# Altium schematic sheet 1.SchDoc
size 840 x 594 mm; SheetNumber: 1; SheetTotal: 10
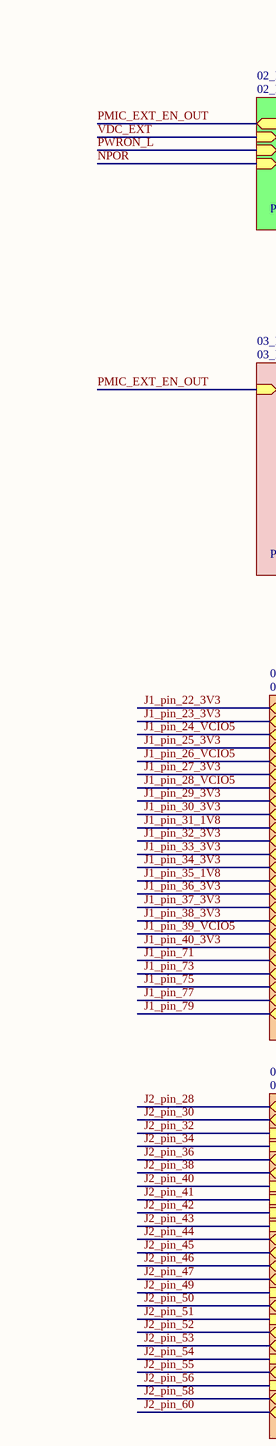
[diagram p0: 1.SchDoc, centre left]
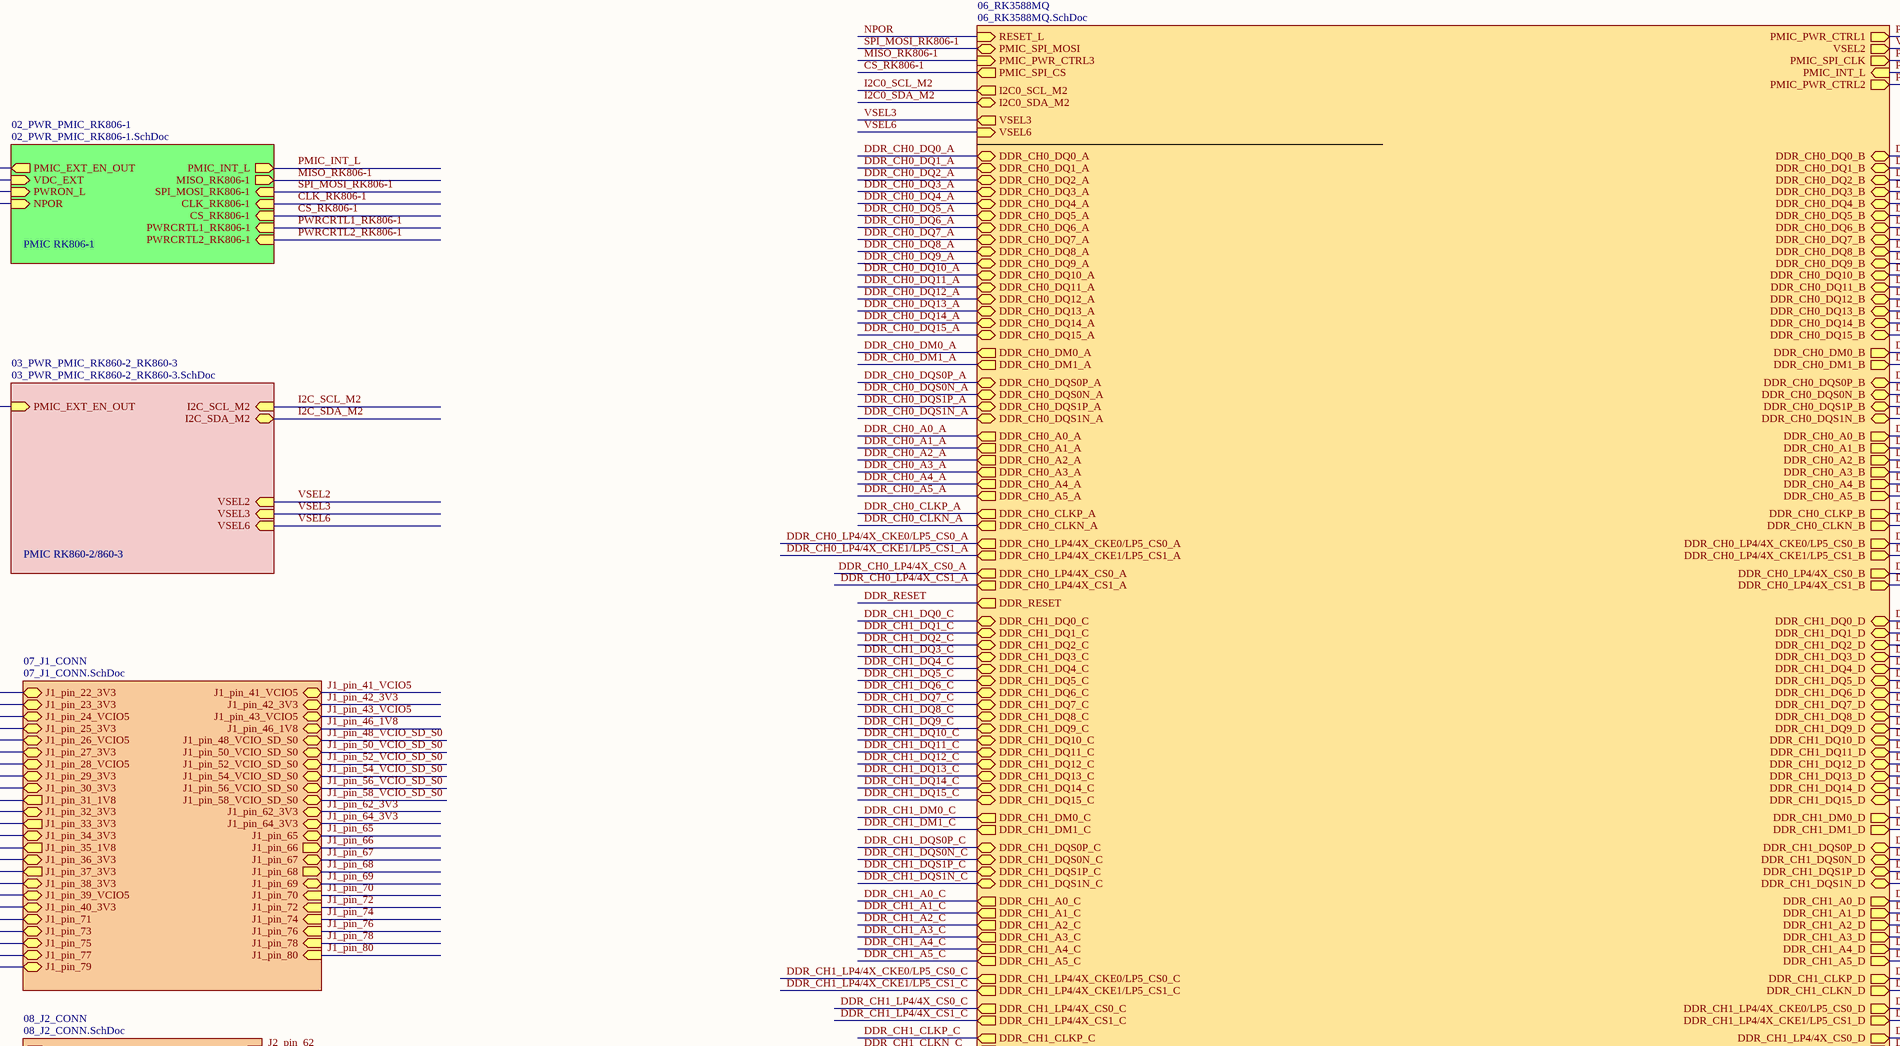
[diagram p1: 1.SchDoc, centre middle]
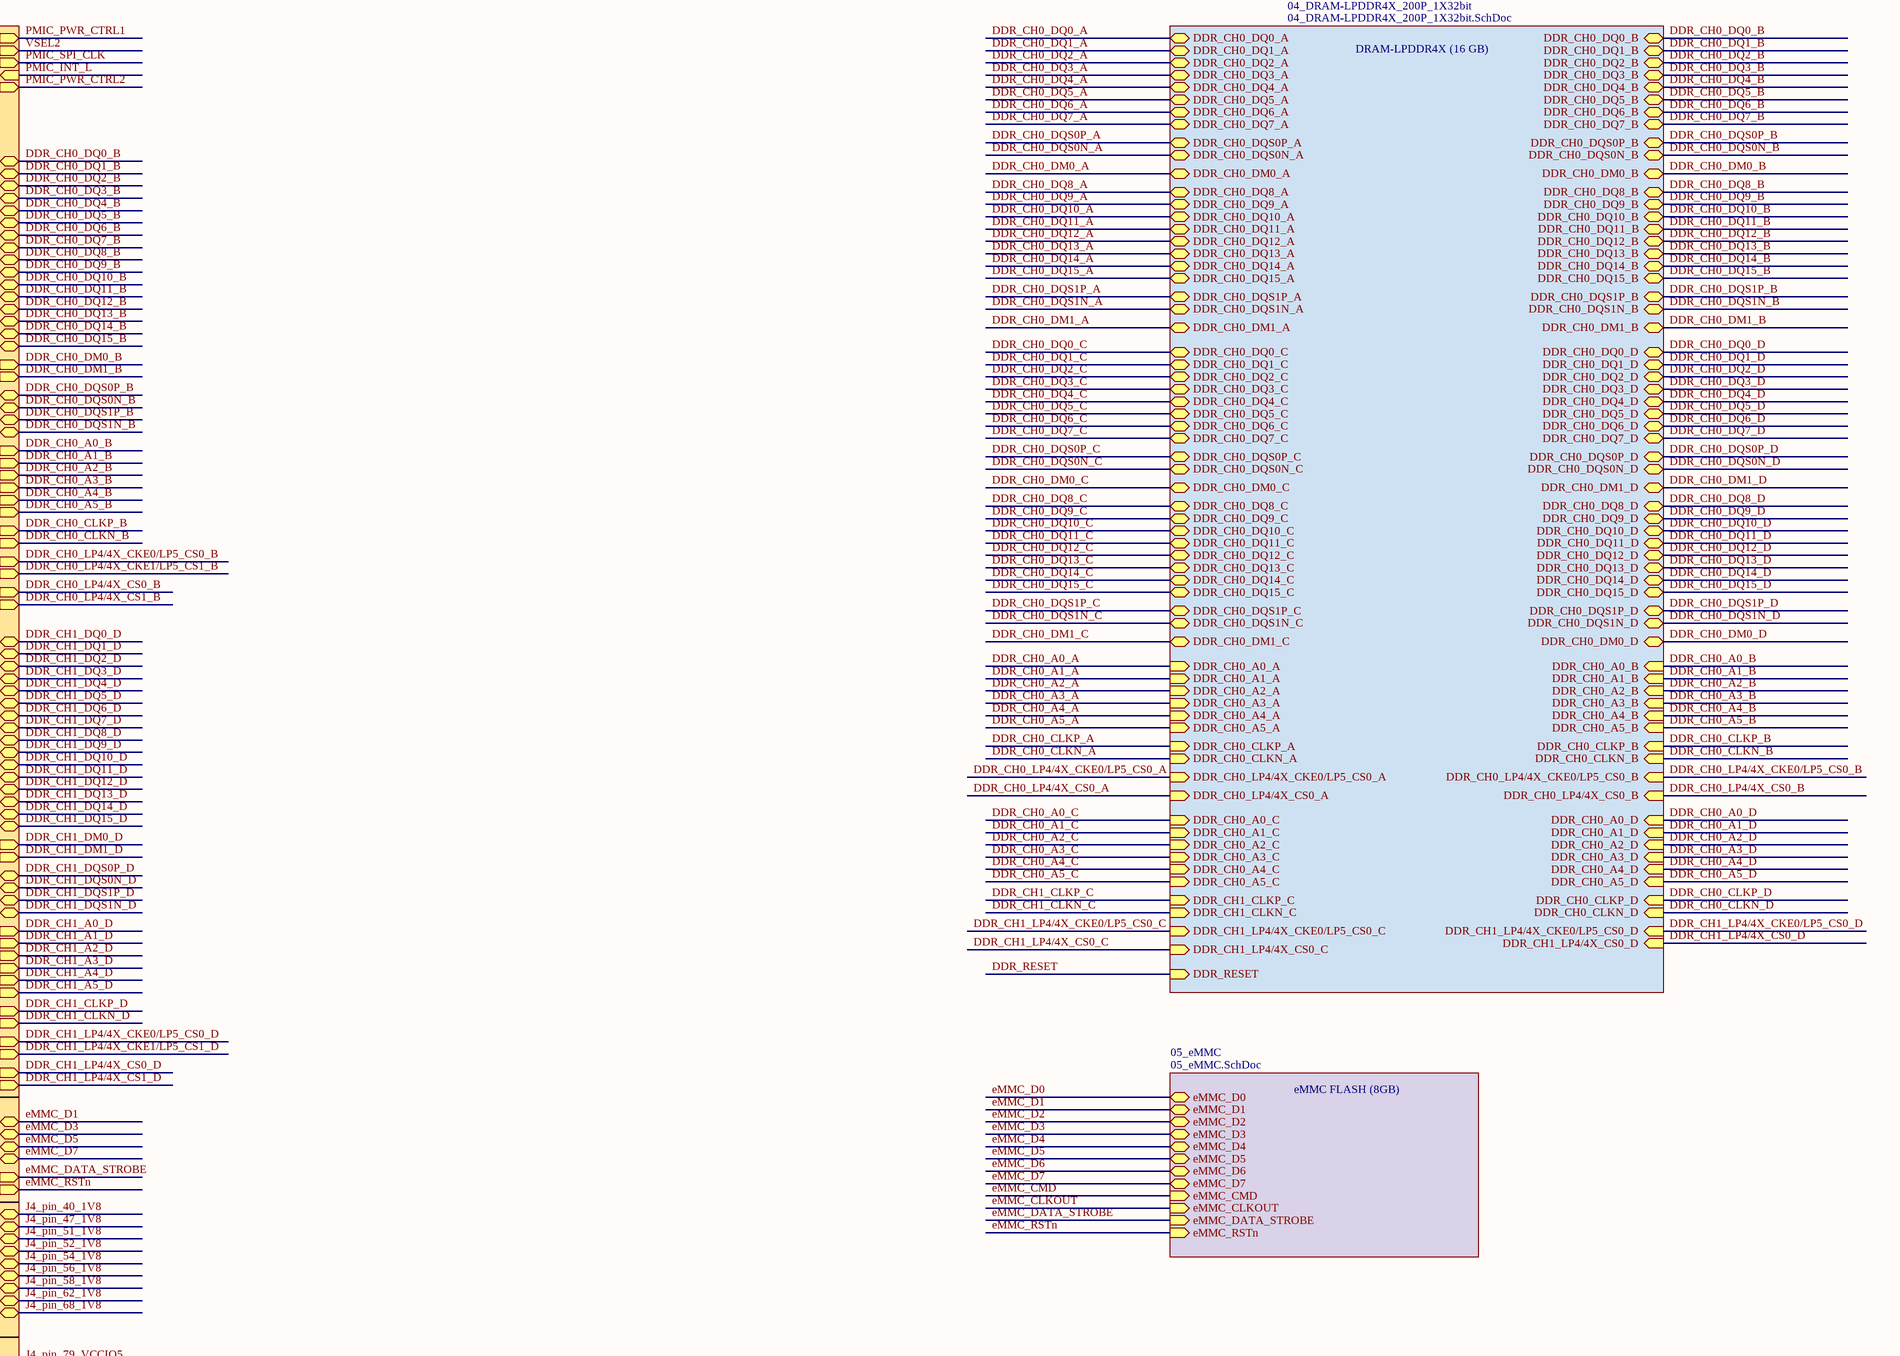
[diagram p2: 1.SchDoc, centre right]
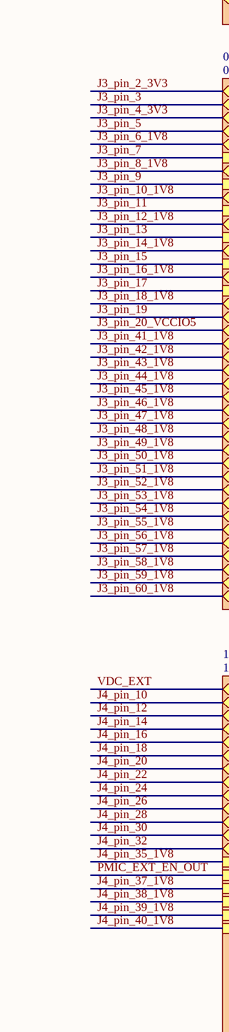
[diagram p3: 1.SchDoc, bottom left]
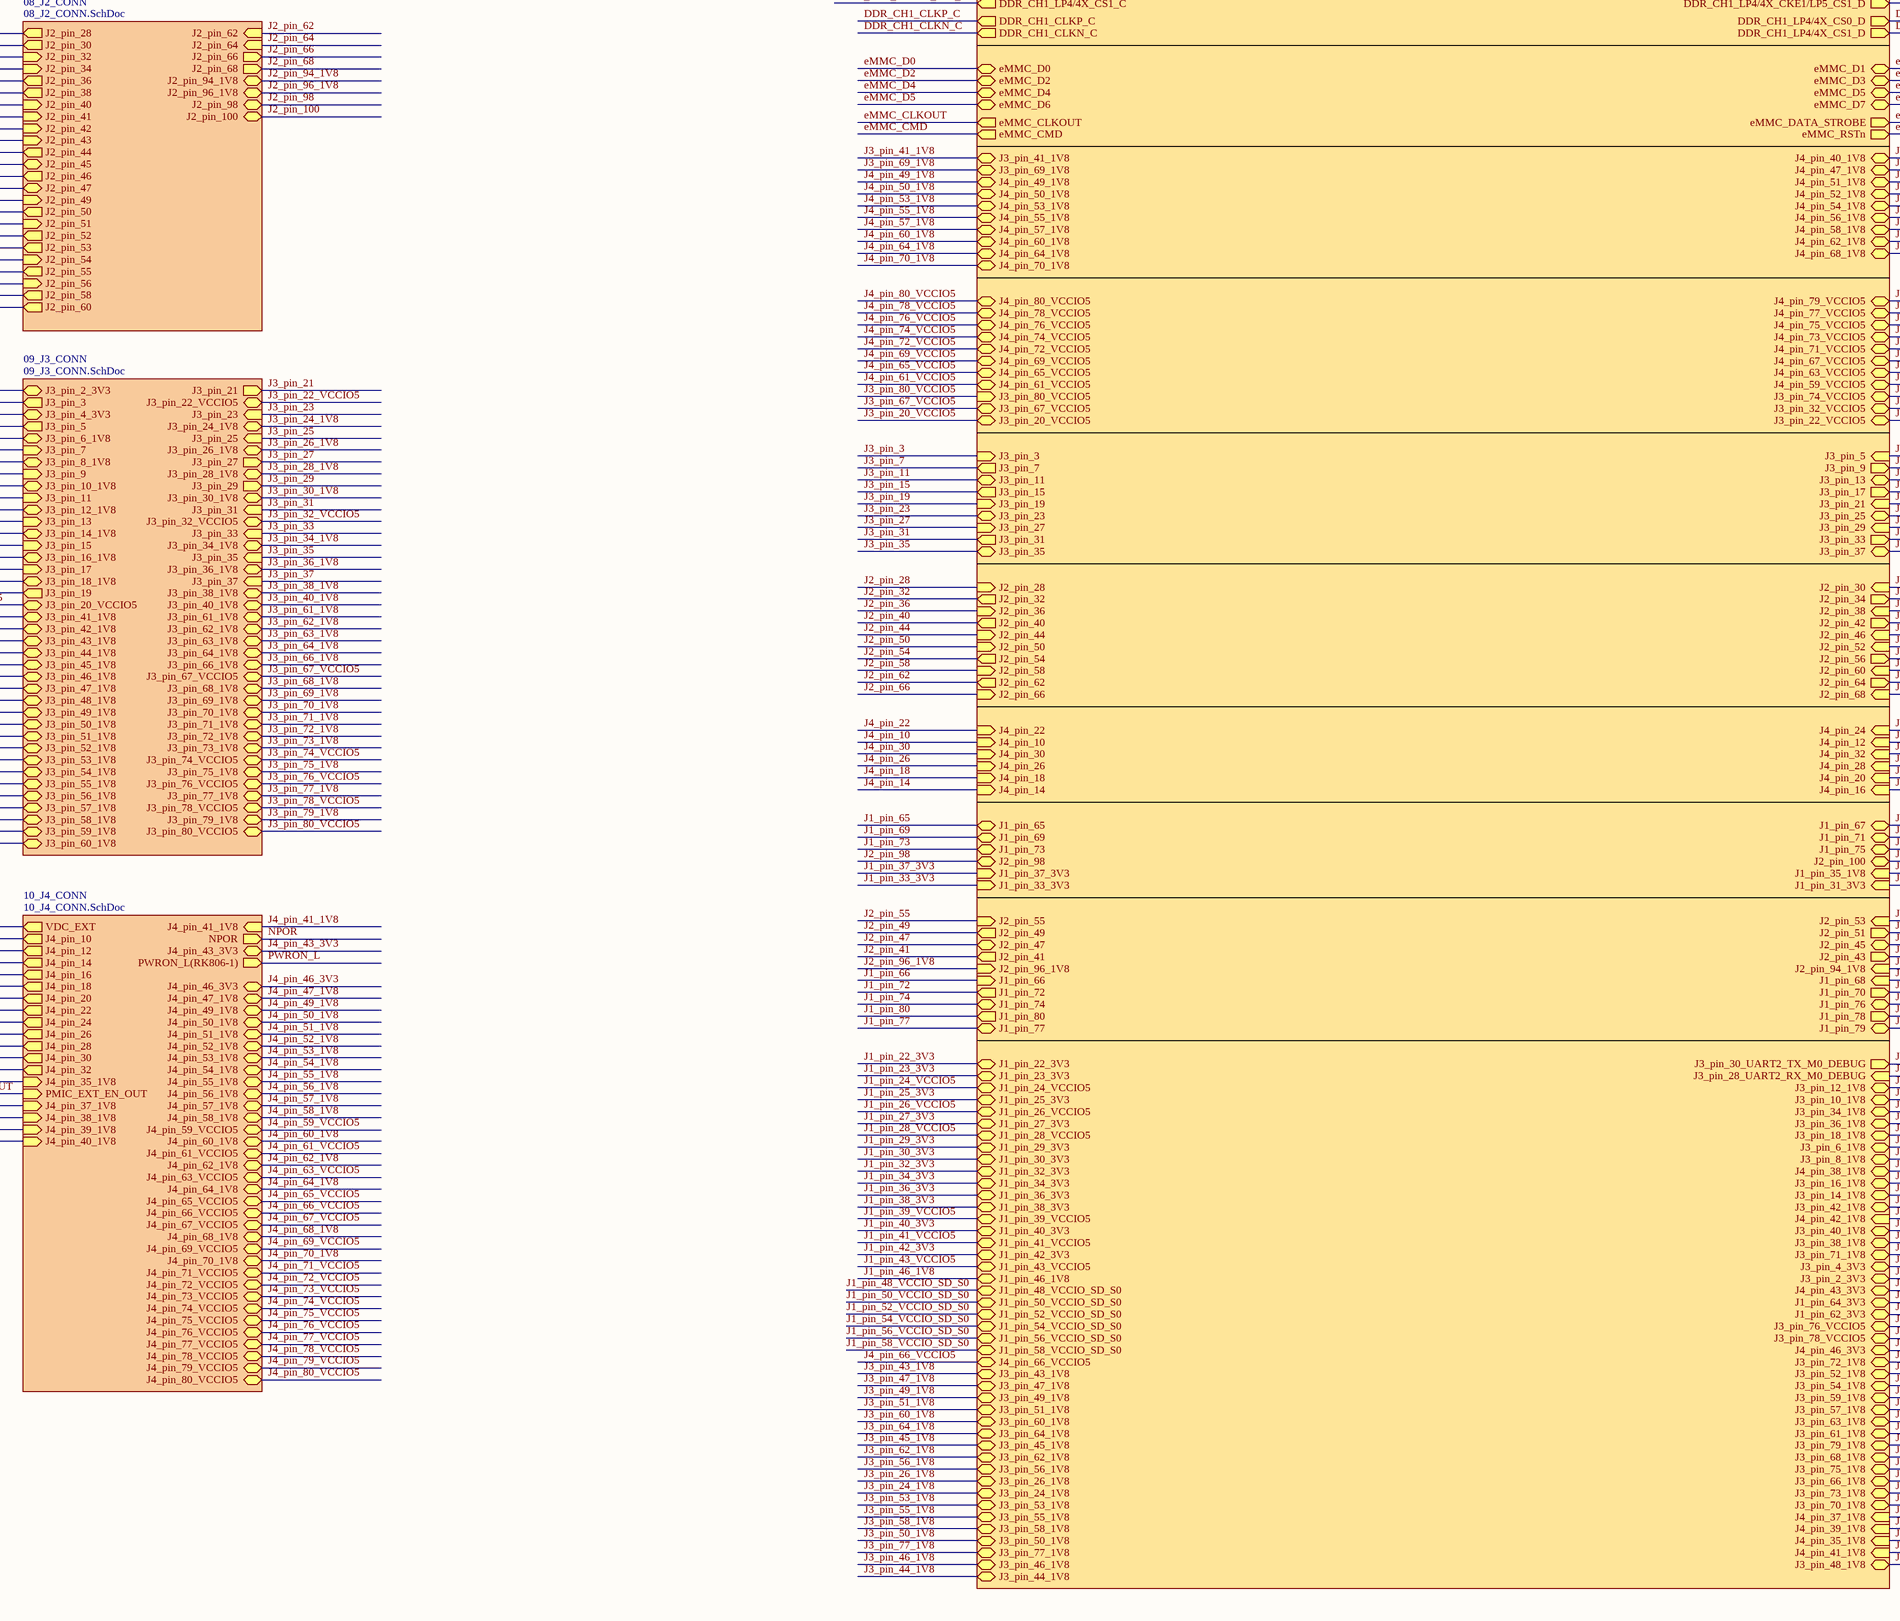
[diagram p4: 1.SchDoc, bottom middle]
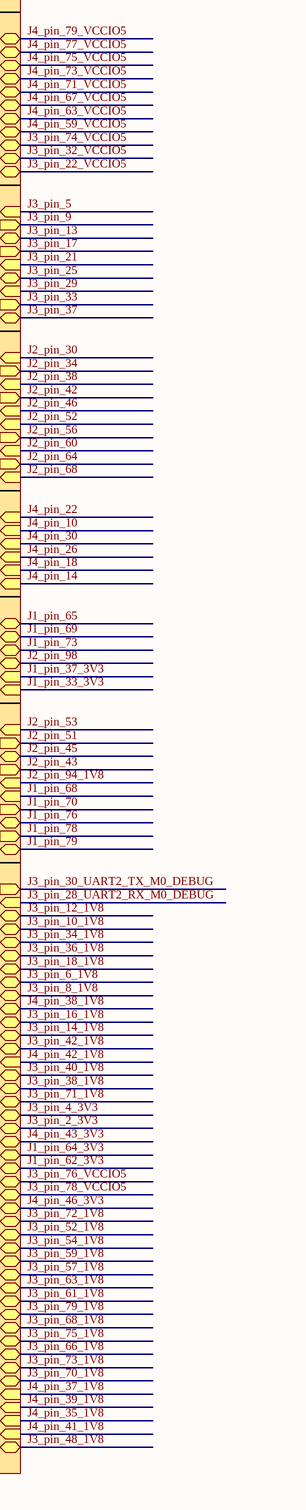
[diagram p5: 1.SchDoc, bottom right]

## Sub-sheets
02_PWR_PMIC_RK806-1 = 02_PWR_PMIC_RK806-1.SchDoc: MISO_RK806-1 (out), PWRCRTL1_RK806-1 (in), PWRCRTL2_RK806-1 (in), CS_RK806-1 (in), CLK_RK806-1 (in), SPI_MOSI_RK806-1 (in), PMIC_INT_L (out), VDC_EXT (in), PMIC_EXT_EN_OUT (out), PWRON_L (in), NPOR (in)
03_PWR_PMIC_RK860-2_RK860-3 = 03_PWR_PMIC_RK860-2_RK860-3.SchDoc: I2C_SCL_M2 (in), PMIC_EXT_EN_OUT (in), I2C_SDA_M2 (bidir), VSEL6 (in), VSEL3 (in), VSEL2 (in)
04_DRAM-LPDDR4X_200P_1X32bit = 04_DRAM-LPDDR4X_200P_1X32bit.SchDoc: DDR_CH0_DQ0_A (bidir), DDR_CH0_DQ1_A (bidir), DDR_CH0_DQ2_A (bidir), DDR_CH0_DQ3_A (bidir), DDR_CH0_DQ4_A (bidir), DDR_CH0_DQ5_A (bidir), DDR_CH0_DQ6_A (bidir), DDR_CH0_DQ7_A (bidir), DDR_CH0_DQ0_B (bidir), DDR_CH0_DQ1_B (bidir), DDR_CH0_DQ2_B (bidir), DDR_CH0_DQ3_B (bidir), DDR_CH0_DQ4_B (bidir), DDR_CH0_DQ5_B (bidir), DDR_CH0_DQ6_B (bidir), DDR_CH0_DQ7_B (bidir), DDR_CH0_DQS0P_B (bidir), DDR_CH0_DM0_A (bidir), DDR_CH0_DQS0P_A (bidir), DDR_CH0_DQS0N_A (bidir), DDR_CH0_DQ15_A (bidir), DDR_CH0_DQ14_A (bidir), DDR_CH0_DQ13_A (bidir), DDR_CH0_DQ12_A (bidir), DDR_CH0_DQ11_A (bidir), DDR_CH0_DQ10_A (bidir), DDR_CH0_DQ9_A (bidir), DDR_CH0_DQ8_A (bidir), DDR_CH0_DM1_A (bidir), DDR_CH0_DQ7_C (bidir), DDR_CH0_DQ6_C (bidir), DDR_CH0_DQ5_C (bidir), DDR_CH0_DQ4_C (bidir), DDR_CH0_DQ3_C (bidir), DDR_CH0_DQ2_C (bidir), DDR_CH0_DQ1_C (bidir), DDR_CH0_DQ0_C (bidir), DDR_CH0_DQS0N_C (bidir), DDR_CH0_DQS0P_C (bidir), DDR_CH0_DM0_C (bidir), DDR_CH0_DQS0N_B (bidir), DDR_CH0_DM0_B (bidir), DDR_CH0_DQ8_B (bidir), DDR_CH0_DQ9_B (bidir), DDR_CH0_DQ10_B (bidir), DDR_CH0_DQ11_B (bidir), DDR_CH0_DQ12_B (bidir), DDR_CH0_DQ13_B (bidir), DDR_CH0_DQ14_B (bidir), DDR_CH0_DQ15_B (bidir), DDR_CH0_DQS1P_B (bidir), DDR_CH0_DQS1N_B (bidir), DDR_CH0_DQS1P_A (bidir), DDR_CH0_DQS1N_A (bidir), DDR_CH0_DM1_B (bidir), DDR_CH0_DQ9_C (bidir), DDR_CH0_DQ8_C (bidir), DDR_CH0_DQ10_C (bidir), DDR_CH0_DQ11_C (bidir), DDR_CH0_DQ12_C (bidir), DDR_CH0_DQ13_C (bidir), DDR_CH0_DQ14_C (bidir), DDR_CH0_DQ15_C (bidir), DDR_CH0_DQS1P_C (bidir), DDR_CH0_DQS1N_C (bidir), DDR_CH0_DQ0_D (bidir), DDR_CH0_DQ1_D (bidir), DDR_CH0_DQ2_D (bidir), DDR_CH0_DQ3_D (bidir), DDR_CH0_DQ4_D (bidir), DDR_CH0_DQ5_D (bidir), DDR_CH0_DQ6_D (bidir), DDR_CH0_DQ7_D (bidir), DDR_CH0_DQS0P_D (bidir), DDR_CH0_DM1_D (bidir), DDR_CH0_DQ8_D (bidir), DDR_CH0_DQ9_D (bidir), DDR_CH0_DQ10_D (bidir), DDR_CH0_DQ11_D (bidir), DDR_CH0_DQ12_D (bidir), DDR_CH0_DQ13_D (bidir), DDR_CH0_DQ14_D (bidir), DDR_CH0_DQ15_D (bidir), DDR_CH0_DQS1P_D (bidir), DDR_CH0_DQS1N_D (bidir), DDR_CH0_DM0_D (bidir), DDR_CH0_DM1_C (bidir), DDR_CH0_A5_A (in), DDR_CH0_A4_A (in), DDR_CH0_A3_A (in), DDR_CH0_A2_A (in), DDR_CH0_A1_A (in), DDR_CH0_CLKN_A (in), DDR_CH0_CLKP_A (in), DDR_CH0_LP4/4X_CKE0/LP5_CS0_A (in), DDR_CH0_A5_C (in), DDR_CH0_A4_C (in), DDR_CH0_A3_C (in), DDR_CH0_A2_C (in), DDR_CH0_A1_C (in), DDR_CH0_A0_C (in), DDR_CH0_A0_A (in), DDR_CH0_LP4/4X_CS0_A (in), DDR_CH1_CLKN_C (in), DDR_CH1_CLKP_C (in), DDR_CH1_LP4/4X_CKE0/LP5_CS0_C (in), DDR_CH1_LP4/4X_CS0_C (in), DDR_RESET (in), DDR_CH0_A0_B (in), DDR_CH0_A1_B (in), DDR_CH0_A2_B (in), DDR_CH0_A3_B (in), DDR_CH0_A4_B (in), DDR_CH0_A5_B (in), DDR_CH0_CLKP_B (in), DDR_CH0_CLKN_B (in), DDR_CH0_LP4/4X_CKE0/LP5_CS0_B (in), DDR_CH0_LP4/4X_CS0_B (in), DDR_CH0_A5_D (in), DDR_CH0_A4_D (in), DDR_CH0_A3_D (in), DDR_CH0_A2_D (in), DDR_CH0_A1_D (in), DDR_CH0_A0_D (in), DDR_CH0_CLKP_D (in), DDR_CH0_CLKN_D (in), DDR_CH1_LP4/4X_CS0_D (in), DDR_CH1_LP4/4X_CKE0/LP5_CS0_D (in), DDR_CH0_DQS0N_D (bidir)
05_eMMC = 05_eMMC.SchDoc: eMMC_DATA_STROBE (in), eMMC_CLKOUT (in), eMMC_D7 (bidir), eMMC_D6 (bidir), eMMC_D5 (bidir), eMMC_D4 (bidir), eMMC_D3 (bidir), eMMC_D2 (bidir), eMMC_D1 (bidir), eMMC_CMD (in), eMMC_RSTn (in), eMMC_D0 (bidir)
06_RK3588MQ = 06_RK3588MQ.SchDoc: RESET_L (in), PMIC_SPI_MOSI (bidir), PMIC_PWR_CTRL3 (in), VSEL6 (in), I2C0_SDA_M2 (bidir), I2C0_SCL_M2 (out), PMIC_SPI_CS (out), VSEL3 (out), DDR_CH0_DQ5_A (bidir), DDR_CH0_DQ4_A (bidir), DDR_CH0_DQ3_A (bidir), DDR_CH0_DQ2_A (bidir), DDR_CH0_DQ1_A (bidir), DDR_CH0_DQ0_A (bidir), DDR_CH0_DQ6_A (bidir), DDR_CH0_DQ7_A (bidir), DDR_CH0_DQ8_A (bidir), DDR_CH0_DQ9_A (bidir), VSEL2 (out), PMIC_PWR_CTRL1 (out), PMIC_SPI_CLK (out), PMIC_INT_L (in), PMIC_PWR_CTRL2 (out), DDR_CH0_DQ0_B (bidir), DDR_CH0_DQ1_B (bidir), DDR_CH0_DQ2_B (bidir), DDR_CH0_DQ3_B (bidir), DDR_CH0_DQ4_B (bidir), DDR_CH0_DQ5_B (bidir), DDR_CH0_DQ6_B (bidir), DDR_CH0_DQ7_B (bidir), DDR_CH0_DQ8_B (bidir), DDR_CH0_DQ9_B (bidir), DDR_CH0_DQ10_B (bidir), DDR_CH0_DQ11_B (bidir), DDR_CH0_DQ12_B (bidir), DDR_CH0_DQ13_B (bidir), DDR_CH0_DQ14_B (bidir), DDR_CH0_DQ15_B (bidir), DDR_CH0_DQ10_A (bidir), DDR_CH0_DQ11_A (bidir), DDR_CH0_DQ12_A (bidir), DDR_CH0_DQ13_A (bidir), DDR_CH0_DQ14_A (bidir), DDR_CH0_DQ15_A (bidir), DDR_CH0_DM0_A (out), DDR_CH0_DM1_A (out), DDR_CH0_DQS0P_A (bidir), DDR_CH0_DQS0N_A (bidir), DDR_CH0_DQS1P_A (bidir), DDR_CH0_DQS1N_A (bidir), DDR_CH0_DM0_B (out), DDR_CH0_DM1_B (out), DDR_CH0_DQS0P_B (bidir), DDR_CH0_DQS0N_B (bidir), DDR_CH0_DQS1P_B (bidir), DDR_CH0_DQS1N_B (bidir), DDR_CH0_A0_B (out), DDR_CH0_A1_B (out), DDR_CH0_A2_B (out), DDR_CH0_A3_B (out), DDR_CH0_A4_B (out), DDR_CH0_A5_B (out), DDR_CH0_A5_A (out), DDR_CH0_A4_A (out), DDR_CH0_A3_A (out), DDR_CH0_A2_A (out), DDR_CH0_A1_A (out), DDR_CH0_A0_A (out), DDR_CH0_CLKP_A (out), DDR_CH0_CLKN_A (out), DDR_CH0_LP4/4X_CKE0/LP5_CS0_A (out), DDR_CH0_LP4/4X_CS1_A (out), DDR_CH0_LP4/4X_CS0_A (out), DDR_CH0_CLKP_B (out), DDR_CH0_CLKN_B (out), DDR_CH0_LP4/4X_CKE0/LP5_CS0_B (out), DDR_CH0_LP4/4X_CS0_B (out), DDR_CH0_LP4/4X_CS1_B (out), DDR_RESET (out), DDR_CH1_DQ0_C (bidir), DDR_CH1_DQ1_C (bidir), DDR_CH1_DQ2_C (bidir), DDR_CH1_DQ3_C (bidir), DDR_CH1_DQ4_C (bidir), DDR_CH1_DQ5_C (bidir), DDR_CH1_DQ6_C (bidir), DDR_CH1_DQ10_C (bidir), DDR_CH1_DQ7_C (bidir), DDR_CH1_DQ8_C (bidir), DDR_CH1_DQ9_C (bidir), DDR_CH1_DQ0_D (bidir), DDR_CH1_DQ1_D (bidir), DDR_CH1_DQ2_D (bidir), DDR_CH1_DQ4_D (bidir), DDR_CH1_DQ5_D (bidir), DDR_CH1_DQ6_D (bidir), DDR_CH1_DQ7_D (bidir), DDR_CH1_DQ8_D (bidir), DDR_CH1_DQ9_D (bidir), DDR_CH1_DQ10_D (bidir), DDR_CH1_DQ11_D (bidir), DDR_CH1_DQ12_D (bidir), DDR_CH1_DQ11_C (bidir), DDR_CH1_DQ12_C (bidir), DDR_CH1_DQ13_C (bidir), DDR_CH1_DQ14_C (bidir), DDR_CH1_DQ15_C (bidir), DDR_CH1_DM0_C (out), DDR_CH1_DM1_C (out), DDR_CH1_DQS0P_C (bidir), DDR_CH1_DQS0N_C (bidir), DDR_CH1_DQS1P_C (bidir), DDR_CH1_DQS1N_C (bidir), DDR_CH1_DQ13_D (bidir), DDR_CH1_DQ14_D (bidir), DDR_CH1_DQ15_D (bidir), DDR_CH1_DM1_D (out), DDR_CH1_DM0_D (out), DDR_CH1_DQS0P_D (bidir), DDR_CH1_DQS0N_D (bidir), DDR_CH1_DQS1P_D (bidir), DDR_CH1_DQS1N_D (bidir), DDR_CH1_A0_C (out), DDR_CH1_A1_C (out), DDR_CH1_A2_C (out), DDR_CH1_A3_C (out), DDR_CH1_A4_C (out), DDR_CH1_A5_C (out), DDR_CH1_A0_D (out), DDR_CH1_A1_D (out), DDR_CH1_A2_D (out), DDR_CH1_A3_D (out), DDR_CH1_A4_D (out), DDR_CH1_A5_D (out), DDR_CH1_CLKP_D (out), DDR_CH1_CLKN_D (out), DDR_CH1_LP4/4X_CKE0/LP5_CS0_D (out), DDR_CH1_LP4/4X_CS0_D (out), DDR_CH1_LP4/4X_CS1_D (out), DDR_CH1_LP4/4X_CKE0/LP5_CS0_C (out), DDR_CH1_LP4/4X_CS0_C (out), DDR_CH1_LP4/4X_CS1_C (out), DDR_CH1_CLKN_C (out), DDR_CH1_CLKP_C (out), eMMC_D0 (bidir), eMMC_D1 (bidir), eMMC_D2 (bidir), eMMC_D3 (bidir), eMMC_D4 (bidir), eMMC_D5 (bidir), eMMC_D6 (bidir), eMMC_D7 (bidir), eMMC_RSTn (out), eMMC_DATA_STROBE (out), eMMC_CLKOUT (out), eMMC_CMD (out), J4_pin_51_1V8 (bidir), J4_pin_54_1V8 (bidir), J4_pin_58_1V8 (bidir), J4_pin_50_1V8 (bidir), J3_pin_41_1V8 (bidir), J3_pin_69_1V8 (bidir), J4_pin_47_1V8 (bidir), J4_pin_49_1V8 (bidir), J4_pin_53_1V8 (bidir), J4_pin_55_1V8 (bidir), J4_pin_56_1V8 (bidir), J4_pin_62_1V8 (bidir), J4_pin_52_1V8 (bidir), J4_pin_68_1V8 (bidir), J4_pin_57_1V8 (bidir), J4_pin_60_1V8 (bidir), J4_pin_64_1V8 (bidir), J4_pin_70_1V8 (bidir), J4_pin_80_VCCIO5 (bidir), J4_pin_79_VCCIO5 (bidir), J4_pin_77_VCCIO5 (bidir), J4_pin_75_VCCIO5 (bidir), J4_pin_73_VCCIO5 (bidir), J4_pin_71_VCCIO5 (bidir), J4_pin_67_VCCIO5 (bidir), J4_pin_63_VCCIO5 (bidir), J4_pin_78_VCCIO5 (bidir), J4_pin_76_VCCIO5 (bidir), J4_pin_74_VCCIO5 (bidir), J4_pin_72_VCCIO5 (bidir), J4_pin_59_VCCIO5 (bidir), J3_pin_74_VCCIO5 (bidir), J3_pin_32_VCCIO5 (bidir), J3_pin_22_VCCIO5 (bidir), J4_pin_69_VCCIO5 (bidir), J4_pin_65_VCCIO5 (bidir), J4_pin_61_VCCIO5 (bidir), J3_pin_80_VCCIO5 (in), J3_pin_67_VCCIO5 (bidir), J3_pin_20_VCCIO5 (bidir), J3_pin_7 (out), J3_pin_15 (out), J3_pin_3 (in), J3_pin_11 (bidir), J3_pin_19 (in), J3_pin_23 (bidir), J3_pin_27 (in), J3_pin_31 (out), J3_pin_35 (bidir), J3_pin_37 (bidir), J3_pin_33 (out), J3_pin_29 (in), J3_pin_25 (bidir), J3_pin_21 (in), J3_pin_17 (out), J3_pin_13 (bidir), J3_pin_9 (out), J3_pin_5 (in), J2_pin_28 (in), J2_pin_32 (out), J2_pin_36 (in), J2_pin_30 (in), J2_pin_38 (in), J2_pin_40 (out), J2_pin_44 (in), J2_pin_50 (in), J2_pin_58 (in), J2_pin_66 (in), J2_pin_54 (out), J2_pin_34 (out), J2_pin_62 (out), J2_pin_42 (out), J2_pin_46 (in), J2_pin_52 (in), J2_pin_56 (out), J2_pin_60 (in), J2_pin_64 (out), J2_pin_68 (in), J4_pin_22 (in), J4_pin_10 (in), J4_pin_24 (in), J4_pin_12 (in), J4_pin_32 (in), J4_pin_20 (in), J4_pin_16 (in), J4_pin_28 (in), J4_pin_30 (in), J4_pin_26 (in), J4_pin_18 (in), J4_pin_14 (in), J1_pin_65 (bidir), J1_pin_69 (bidir), J1_pin_73 (bidir), J1_pin_67 (bidir), J1_pin_71 (bidir), J1_pin_75 (bidir), J2_pin_98 (bidir), J2_pin_100 (bidir), J1_pin_33_3V3 (in), J1_pin_37_3V3 (in), J1_pin_35_1V8 (in), J1_pin_31_3V3 (in), J2_pin_55 (in), J2_pin_53 (in), J2_pin_47 (bidir), J2_pin_49 (out), J2_pin_41 (out), J2_pin_96_1V8 (in), J1_pin_66 (in), J1_pin_72 (out), J1_pin_74 (bidir), J1_pin_80 (out), J1_pin_77 (bidir), J2_pin_51 (out), J2_pin_45 (bidir), J2_pin_43 (out), J2_pin_94_1V8 (in), J1_pin_68 (in), J1_pin_70 (out), J1_pin_76 (bidir), J1_pin_78 (out), J1_pin_79 (bidir), J1_pin_22_3V3 (bidir), J1_pin_23_3V3 (bidir), J1_pin_24_VCCIO5 (bidir), J1_pin_25_3V3 (bidir), J1_pin_26_VCCIO5 (bidir), J1_pin_27_3V3 (bidir), J1_pin_28_VCCIO5 (bidir), J1_pin_29_3V3 (bidir), J1_pin_30_3V3 (bidir), J1_pin_32_3V3 (bidir), J1_pin_34_3V3 (bidir), J1_pin_36_3V3 (bidir), J1_pin_38_3V3 (bidir), J1_pin_40_3V3 (bidir), J1_pin_39_VCCIO5 (bidir), J1_pin_42_3V3 (bidir), J1_pin_41_VCCIO5 (bidir), J1_pin_58_VCCIO_SD_S0 (bidir), J1_pin_56_VCCIO_SD_S0 (bidir), J1_pin_54_VCCIO_SD_S0 (bidir), J1_pin_52_VCCIO_SD_S0 (bidir), J1_pin_50_VCCIO_SD_S0 (bidir), J1_pin_48_VCCIO_SD_S0 (bidir), J1_pin_46_1V8 (bidir), J4_pin_66_VCCIO5 (bidir), J3_pin_47_1V8 (bidir), J3_pin_43_1V8 (bidir), J3_pin_49_1V8 (bidir), J3_pin_51_1V8 (bidir), J3_pin_60_1V8 (bidir), J3_pin_64_1V8 (bidir), J3_pin_45_1V8 (bidir), J3_pin_62_1V8 (bidir), J3_pin_56_1V8 (bidir), J3_pin_26_1V8 (bidir), J3_pin_24_1V8 (bidir), J3_pin_53_1V8 (bidir), J3_pin_55_1V8 (bidir), J3_pin_58_1V8 (bidir), J3_pin_50_1V8 (bidir), J3_pin_77_1V8 (bidir), J3_pin_46_1V8 (bidir), J3_pin_44_1V8 (bidir), J3_pin_30_UART2_TX_M0_DEBUG (out), J3_pin_28_UART2_RX_M0_DEBUG (in), J3_pin_12_1V8 (bidir), J3_pin_10_1V8 (bidir), J3_pin_34_1V8 (bidir), J3_pin_36_1V8 (bidir), J3_pin_18_1V8 (bidir), J3_pin_6_1V8 (bidir), J3_pin_8_1V8 (bidir), J3_pin_16_1V8 (bidir), J3_pin_14_1V8 (bidir), J3_pin_42_1V8 (bidir), J4_pin_38_1V8 (bidir), J4_pin_42_1V8 (in), J3_pin_38_1V8 (bidir), J3_pin_71_1V8 (bidir), J3_pin_4_3V3 (bidir), J3_pin_2_3V3 (bidir), J4_pin_43_3V3 (bidir), J1_pin_64_3V3 (bidir), J1_pin_62_3V3 (bidir), J3_pin_76_VCCIO5 (bidir), J3_pin_78_VCCIO5 (bidir), J4_pin_46_3V3 (bidir), J3_pin_72_1V8 (bidir), J3_pin_52_1V8 (bidir), J3_pin_54_1V8 (bidir), J3_pin_59_1V8 (bidir), J3_pin_57_1V8 (bidir), J3_pin_63_1V8 (bidir), J3_pin_61_1V8 (bidir), J3_pin_79_1V8 (bidir), J3_pin_68_1V8 (bidir), J3_pin_75_1V8 (bidir), J3_pin_66_1V8 (bidir), J3_pin_73_1V8 (bidir), J3_pin_70_1V8 (bidir), J4_pin_37_1V8 (in), J4_pin_39_1V8 (in), J4_pin_35_1V8 (in), J4_pin_41_1V8 (in), J3_pin_48_1V8 (bidir), J3_pin_40_1V8 (bidir), J4_pin_40_1V8 (bidir), J1_pin_43_VCCIO5 (bidir), DDR_CH1_DQ3_D (bidir), DDR_CH0_LP4/4X_CKE1/LP5_CS1_A (out), DDR_CH1_LP4/4X_CKE1/LP5_CS1_C (out), DDR_CH1_LP4/4X_CKE1/LP5_CS1_D (out), DDR_CH0_LP4/4X_CKE1/LP5_CS1_B (out)
07_J1_CONN = 07_J1_CONN.SchDoc: J1_pin_22_3V3 (bidir), J1_pin_23_3V3 (bidir), J1_pin_24_VCIO5 (bidir), J1_pin_25_3V3 (bidir), J1_pin_26_VCIO5 (bidir), J1_pin_27_3V3 (bidir), J1_pin_28_VCIO5 (bidir), J1_pin_29_3V3 (bidir), J1_pin_30_3V3 (bidir), J1_pin_41_VCIO5 (bidir), J1_pin_42_3V3 (bidir), J1_pin_43_VCIO5 (bidir), J1_pin_46_1V8 (bidir), J1_pin_48_VCIO_SD_S0 (bidir), J1_pin_50_VCIO_SD_S0 (bidir), J1_pin_52_VCIO_SD_S0 (bidir), J1_pin_54_VCIO_SD_S0 (bidir), J1_pin_56_VCIO_SD_S0 (bidir), J1_pin_58_VCIO_SD_S0 (bidir), J1_pin_62_3V3 (bidir), J1_pin_64_3V3 (bidir), J1_pin_65 (bidir), J1_pin_66 (out), J1_pin_67 (bidir), J1_pin_68 (out), J1_pin_69 (bidir), J1_pin_70 (in), J1_pin_72 (in), J1_pin_74 (in), J1_pin_76 (in), J1_pin_78 (in), J1_pin_80 (in), J1_pin_34_3V3 (bidir), J1_pin_32_3V3 (bidir), J1_pin_31_1V8 (out), J1_pin_33_3V3 (out), J1_pin_35_1V8 (out), J1_pin_36_3V3 (bidir), J1_pin_37_3V3 (out), J1_pin_38_3V3 (bidir), J1_pin_39_VCIO5 (bidir), J1_pin_40_3V3 (bidir), J1_pin_71 (bidir), J1_pin_73 (bidir), J1_pin_75 (bidir), J1_pin_77 (bidir), J1_pin_79 (bidir)
08_J2_CONN = 08_J2_CONN.SchDoc: J2_pin_28 (out), J2_pin_30 (out), J2_pin_32 (in), J2_pin_34 (in), J2_pin_36 (out), J2_pin_40 (in), J2_pin_38 (out), J2_pin_41 (in), J2_pin_42 (in), J2_pin_43 (in), J2_pin_44 (out), J2_pin_45 (bidir), J2_pin_46 (out), J2_pin_47 (bidir), J2_pin_49 (in), J2_pin_50 (out), J2_pin_51 (in), J2_pin_52 (out), J2_pin_53 (out), J2_pin_54 (in), J2_pin_55 (out), J2_pin_56 (in), J2_pin_58 (out), J2_pin_60 (out), J2_pin_62 (in), J2_pin_64 (in), J2_pin_66 (out), J2_pin_68 (out), J2_pin_94_1V8 (bidir), J2_pin_96_1V8 (bidir), J2_pin_98 (bidir), J2_pin_100 (bidir)
09_J3_CONN = 09_J3_CONN.SchDoc: J3_pin_2_3V3 (bidir), J3_pin_27 (out), J3_pin_28_1V8 (bidir), J3_pin_29 (out), J3_pin_30_1V8 (bidir), J3_pin_26_1V8 (bidir), J3_pin_25 (in), J3_pin_31 (in), J3_pin_32_VCCIO5 (bidir), J3_pin_33 (in), J3_pin_34_1V8 (bidir), J3_pin_35 (in), J3_pin_36_1V8 (bidir), J3_pin_37 (in), J3_pin_38_1V8 (bidir), J3_pin_40_1V8 (bidir), J3_pin_61_1V8 (bidir), J3_pin_62_1V8 (bidir), J3_pin_63_1V8 (bidir), J3_pin_64_1V8 (bidir), J3_pin_66_1V8 (bidir), J3_pin_67_VCCIO5 (bidir), J3_pin_68_1V8 (bidir), J3_pin_69_1V8 (bidir), J3_pin_70_1V8 (bidir), J3_pin_72_1V8 (bidir), J3_pin_73_1V8 (bidir), J3_pin_71_1V8 (bidir), J3_pin_74_VCCIO5 (bidir), J3_pin_75_1V8 (bidir), J3_pin_76_VCCIO5 (bidir), J3_pin_77_1V8 (bidir), J3_pin_79_1V8 (bidir), J3_pin_78_VCCIO5 (bidir), J3_pin_80_VCCIO5 (bidir), J3_pin_21 (out), J3_pin_22_VCCIO5 (bidir), J3_pin_23 (in), J3_pin_24_1V8 (bidir), J3_pin_3 (out), J3_pin_7 (in), J3_pin_8_1V8 (bidir), J3_pin_9 (in), J3_pin_10_1V8 (bidir), J3_pin_11 (in), J3_pin_4_3V3 (bidir), J3_pin_5 (out), J3_pin_12_1V8 (bidir), J3_pin_13 (in), J3_pin_14_1V8 (bidir), J3_pin_15 (in), J3_pin_16_1V8 (bidir), J3_pin_17 (in), J3_pin_18_1V8 (bidir), J3_pin_19 (out), J3_pin_20_VCCIO5 (bidir), J3_pin_41_1V8 (bidir), J3_pin_42_1V8 (bidir), J3_pin_43_1V8 (bidir), J3_pin_44_1V8 (bidir), J3_pin_45_1V8 (bidir), J3_pin_46_1V8 (bidir), J3_pin_47_1V8 (bidir), J3_pin_48_1V8 (bidir), J3_pin_49_1V8 (bidir), J3_pin_50_1V8 (bidir), J3_pin_51_1V8 (bidir), J3_pin_52_1V8 (bidir), J3_pin_53_1V8 (bidir), J3_pin_54_1V8 (bidir), J3_pin_55_1V8 (bidir), J3_pin_56_1V8 (bidir), J3_pin_57_1V8 (bidir), J3_pin_58_1V8 (bidir), J3_pin_59_1V8 (bidir), J3_pin_60_1V8 (bidir), J3_pin_6_1V8 (bidir)
10_J4_CONN = 10_J4_CONN.SchDoc: VDC_EXT (out), J4_pin_41_1V8 (in), J4_pin_10 (out), NPOR (out), J4_pin_12 (out), J4_pin_43_3V3 (bidir), J4_pin_14 (out), PWRON_L(RK806-1) (out), J4_pin_16 (out), J4_pin_18 (out), J4_pin_46_3V3 (bidir), J4_pin_20 (out), J4_pin_22 (out), J4_pin_47_1V8 (bidir), J4_pin_49_1V8 (bidir), J4_pin_24 (out), J4_pin_50_1V8 (bidir), J4_pin_26 (out), J4_pin_51_1V8 (bidir), J4_pin_28 (out), J4_pin_52_1V8 (bidir), J4_pin_30 (out), J4_pin_53_1V8 (bidir), J4_pin_32 (out), J4_pin_35_1V8 (in), PMIC_EXT_EN_OUT (in), J4_pin_54_1V8 (bidir), J4_pin_55_1V8 (bidir), J4_pin_56_1V8 (bidir), J4_pin_57_1V8 (bidir), J4_pin_37_1V8 (in), J4_pin_58_1V8 (bidir), J4_pin_38_1V8 (in), J4_pin_39_1V8 (in), J4_pin_40_1V8 (in), J4_pin_60_1V8 (bidir), J4_pin_59_VCCIO5 (bidir), J4_pin_61_VCCIO5 (bidir), J4_pin_62_1V8 (bidir), J4_pin_63_VCCIO5 (bidir), J4_pin_64_1V8 (bidir), J4_pin_65_VCCIO5 (bidir), J4_pin_66_VCCIO5 (bidir), J4_pin_67_VCCIO5 (bidir), J4_pin_68_1V8 (bidir), J4_pin_69_VCCIO5 (bidir), J4_pin_70_1V8 (bidir), J4_pin_71_VCCIO5 (bidir), J4_pin_72_VCCIO5 (bidir), J4_pin_73_VCCIO5 (bidir), J4_pin_74_VCCIO5 (bidir), J4_pin_75_VCCIO5 (bidir), J4_pin_76_VCCIO5 (bidir), J4_pin_77_VCCIO5 (bidir), J4_pin_78_VCCIO5 (bidir), J4_pin_79_VCCIO5 (bidir), J4_pin_80_VCCIO5 (bidir)

## Nets
CLK_RK806-1: sheet 02_PWR_PMIC_RK806-1/CLK_RK806-1
CS_RK806-1: sheet 02_PWR_PMIC_RK806-1/CS_RK806-1, sheet 06_RK3588MQ/PMIC_SPI_CS
DDR_CH0_A0_A: sheet 04_DRAM-LPDDR4X_200P_1X32bit/DDR_CH0_A0_A, sheet 06_RK3588MQ/DDR_CH0_A0_A
DDR_CH0_A0_B: sheet 04_DRAM-LPDDR4X_200P_1X32bit/DDR_CH0_A0_B, sheet 06_RK3588MQ/DDR_CH0_A0_B
DDR_CH0_A0_C: sheet 04_DRAM-LPDDR4X_200P_1X32bit/DDR_CH0_A0_C
DDR_CH0_A0_D: sheet 04_DRAM-LPDDR4X_200P_1X32bit/DDR_CH0_A0_D
DDR_CH0_A1_A: sheet 04_DRAM-LPDDR4X_200P_1X32bit/DDR_CH0_A1_A, sheet 06_RK3588MQ/DDR_CH0_A1_A
DDR_CH0_A1_B: sheet 04_DRAM-LPDDR4X_200P_1X32bit/DDR_CH0_A1_B, sheet 06_RK3588MQ/DDR_CH0_A1_B
DDR_CH0_A1_C: sheet 04_DRAM-LPDDR4X_200P_1X32bit/DDR_CH0_A1_C
DDR_CH0_A1_D: sheet 04_DRAM-LPDDR4X_200P_1X32bit/DDR_CH0_A1_D
DDR_CH0_A2_A: sheet 04_DRAM-LPDDR4X_200P_1X32bit/DDR_CH0_A2_A, sheet 06_RK3588MQ/DDR_CH0_A2_A
DDR_CH0_A2_B: sheet 04_DRAM-LPDDR4X_200P_1X32bit/DDR_CH0_A2_B, sheet 06_RK3588MQ/DDR_CH0_A2_B
DDR_CH0_A2_C: sheet 04_DRAM-LPDDR4X_200P_1X32bit/DDR_CH0_A2_C
DDR_CH0_A2_D: sheet 04_DRAM-LPDDR4X_200P_1X32bit/DDR_CH0_A2_D
DDR_CH0_A3_A: sheet 04_DRAM-LPDDR4X_200P_1X32bit/DDR_CH0_A3_A, sheet 06_RK3588MQ/DDR_CH0_A3_A
DDR_CH0_A3_B: sheet 04_DRAM-LPDDR4X_200P_1X32bit/DDR_CH0_A3_B, sheet 06_RK3588MQ/DDR_CH0_A3_B
DDR_CH0_A3_C: sheet 04_DRAM-LPDDR4X_200P_1X32bit/DDR_CH0_A3_C
DDR_CH0_A3_D: sheet 04_DRAM-LPDDR4X_200P_1X32bit/DDR_CH0_A3_D
DDR_CH0_A4_A: sheet 04_DRAM-LPDDR4X_200P_1X32bit/DDR_CH0_A4_A, sheet 06_RK3588MQ/DDR_CH0_A4_A
DDR_CH0_A4_B: sheet 04_DRAM-LPDDR4X_200P_1X32bit/DDR_CH0_A4_B, sheet 06_RK3588MQ/DDR_CH0_A4_B
DDR_CH0_A4_C: sheet 04_DRAM-LPDDR4X_200P_1X32bit/DDR_CH0_A4_C
DDR_CH0_A4_D: sheet 04_DRAM-LPDDR4X_200P_1X32bit/DDR_CH0_A4_D
DDR_CH0_A5_A: sheet 04_DRAM-LPDDR4X_200P_1X32bit/DDR_CH0_A5_A, sheet 06_RK3588MQ/DDR_CH0_A5_A
DDR_CH0_A5_B: sheet 04_DRAM-LPDDR4X_200P_1X32bit/DDR_CH0_A5_B, sheet 06_RK3588MQ/DDR_CH0_A5_B
DDR_CH0_A5_C: sheet 04_DRAM-LPDDR4X_200P_1X32bit/DDR_CH0_A5_C
DDR_CH0_A5_D: sheet 04_DRAM-LPDDR4X_200P_1X32bit/DDR_CH0_A5_D
DDR_CH0_CLKN_A: sheet 04_DRAM-LPDDR4X_200P_1X32bit/DDR_CH0_CLKN_A, sheet 06_RK3588MQ/DDR_CH0_CLKN_A
DDR_CH0_CLKN_B: sheet 04_DRAM-LPDDR4X_200P_1X32bit/DDR_CH0_CLKN_B, sheet 06_RK3588MQ/DDR_CH0_CLKN_B
DDR_CH0_CLKN_D: sheet 04_DRAM-LPDDR4X_200P_1X32bit/DDR_CH0_CLKN_D
DDR_CH0_CLKP_A: sheet 04_DRAM-LPDDR4X_200P_1X32bit/DDR_CH0_CLKP_A, sheet 06_RK3588MQ/DDR_CH0_CLKP_A
DDR_CH0_CLKP_B: sheet 04_DRAM-LPDDR4X_200P_1X32bit/DDR_CH0_CLKP_B, sheet 06_RK3588MQ/DDR_CH0_CLKP_B
DDR_CH0_CLKP_D: sheet 04_DRAM-LPDDR4X_200P_1X32bit/DDR_CH0_CLKP_D
DDR_CH0_DM0_A: sheet 04_DRAM-LPDDR4X_200P_1X32bit/DDR_CH0_DM0_A, sheet 06_RK3588MQ/DDR_CH0_DM0_A
DDR_CH0_DM0_B: sheet 04_DRAM-LPDDR4X_200P_1X32bit/DDR_CH0_DM0_B, sheet 06_RK3588MQ/DDR_CH0_DM0_B
DDR_CH0_DM0_C: sheet 04_DRAM-LPDDR4X_200P_1X32bit/DDR_CH0_DM0_C
DDR_CH0_DM0_D: sheet 04_DRAM-LPDDR4X_200P_1X32bit/DDR_CH0_DM0_D
DDR_CH0_DM1_A: sheet 04_DRAM-LPDDR4X_200P_1X32bit/DDR_CH0_DM1_A, sheet 06_RK3588MQ/DDR_CH0_DM1_A
DDR_CH0_DM1_B: sheet 04_DRAM-LPDDR4X_200P_1X32bit/DDR_CH0_DM1_B, sheet 06_RK3588MQ/DDR_CH0_DM1_B
DDR_CH0_DM1_C: sheet 04_DRAM-LPDDR4X_200P_1X32bit/DDR_CH0_DM1_C
DDR_CH0_DM1_D: sheet 04_DRAM-LPDDR4X_200P_1X32bit/DDR_CH0_DM1_D
DDR_CH0_DQ0_A: sheet 04_DRAM-LPDDR4X_200P_1X32bit/DDR_CH0_DQ0_A, sheet 06_RK3588MQ/DDR_CH0_DQ0_A
DDR_CH0_DQ0_B: sheet 04_DRAM-LPDDR4X_200P_1X32bit/DDR_CH0_DQ0_B, sheet 06_RK3588MQ/DDR_CH0_DQ0_B
DDR_CH0_DQ0_C: sheet 04_DRAM-LPDDR4X_200P_1X32bit/DDR_CH0_DQ0_C
DDR_CH0_DQ0_D: sheet 04_DRAM-LPDDR4X_200P_1X32bit/DDR_CH0_DQ0_D
DDR_CH0_DQ1_A: sheet 04_DRAM-LPDDR4X_200P_1X32bit/DDR_CH0_DQ1_A, sheet 06_RK3588MQ/DDR_CH0_DQ1_A
DDR_CH0_DQ1_B: sheet 04_DRAM-LPDDR4X_200P_1X32bit/DDR_CH0_DQ1_B, sheet 06_RK3588MQ/DDR_CH0_DQ1_B
DDR_CH0_DQ1_C: sheet 04_DRAM-LPDDR4X_200P_1X32bit/DDR_CH0_DQ1_C
DDR_CH0_DQ1_D: sheet 04_DRAM-LPDDR4X_200P_1X32bit/DDR_CH0_DQ1_D
DDR_CH0_DQ2_A: sheet 04_DRAM-LPDDR4X_200P_1X32bit/DDR_CH0_DQ2_A, sheet 06_RK3588MQ/DDR_CH0_DQ2_A
DDR_CH0_DQ2_B: sheet 04_DRAM-LPDDR4X_200P_1X32bit/DDR_CH0_DQ2_B, sheet 06_RK3588MQ/DDR_CH0_DQ2_B
DDR_CH0_DQ2_C: sheet 04_DRAM-LPDDR4X_200P_1X32bit/DDR_CH0_DQ2_C
DDR_CH0_DQ2_D: sheet 04_DRAM-LPDDR4X_200P_1X32bit/DDR_CH0_DQ2_D
DDR_CH0_DQ3_A: sheet 04_DRAM-LPDDR4X_200P_1X32bit/DDR_CH0_DQ3_A, sheet 06_RK3588MQ/DDR_CH0_DQ3_A
DDR_CH0_DQ3_B: sheet 04_DRAM-LPDDR4X_200P_1X32bit/DDR_CH0_DQ3_B, sheet 06_RK3588MQ/DDR_CH0_DQ3_B
DDR_CH0_DQ3_C: sheet 04_DRAM-LPDDR4X_200P_1X32bit/DDR_CH0_DQ3_C
DDR_CH0_DQ3_D: sheet 04_DRAM-LPDDR4X_200P_1X32bit/DDR_CH0_DQ3_D
DDR_CH0_DQ4_A: sheet 04_DRAM-LPDDR4X_200P_1X32bit/DDR_CH0_DQ4_A, sheet 06_RK3588MQ/DDR_CH0_DQ4_A
DDR_CH0_DQ4_B: sheet 04_DRAM-LPDDR4X_200P_1X32bit/DDR_CH0_DQ4_B, sheet 06_RK3588MQ/DDR_CH0_DQ4_B
DDR_CH0_DQ4_C: sheet 04_DRAM-LPDDR4X_200P_1X32bit/DDR_CH0_DQ4_C
DDR_CH0_DQ4_D: sheet 04_DRAM-LPDDR4X_200P_1X32bit/DDR_CH0_DQ4_D
DDR_CH0_DQ5_A: sheet 04_DRAM-LPDDR4X_200P_1X32bit/DDR_CH0_DQ5_A, sheet 06_RK3588MQ/DDR_CH0_DQ5_A
DDR_CH0_DQ5_B: sheet 04_DRAM-LPDDR4X_200P_1X32bit/DDR_CH0_DQ5_B, sheet 06_RK3588MQ/DDR_CH0_DQ5_B
DDR_CH0_DQ5_C: sheet 04_DRAM-LPDDR4X_200P_1X32bit/DDR_CH0_DQ5_C
DDR_CH0_DQ5_D: sheet 04_DRAM-LPDDR4X_200P_1X32bit/DDR_CH0_DQ5_D
DDR_CH0_DQ6_A: sheet 04_DRAM-LPDDR4X_200P_1X32bit/DDR_CH0_DQ6_A, sheet 06_RK3588MQ/DDR_CH0_DQ6_A
DDR_CH0_DQ6_B: sheet 04_DRAM-LPDDR4X_200P_1X32bit/DDR_CH0_DQ6_B, sheet 06_RK3588MQ/DDR_CH0_DQ6_B
DDR_CH0_DQ6_C: sheet 04_DRAM-LPDDR4X_200P_1X32bit/DDR_CH0_DQ6_C
DDR_CH0_DQ6_D: sheet 04_DRAM-LPDDR4X_200P_1X32bit/DDR_CH0_DQ6_D
DDR_CH0_DQ7_A: sheet 04_DRAM-LPDDR4X_200P_1X32bit/DDR_CH0_DQ7_A, sheet 06_RK3588MQ/DDR_CH0_DQ7_A
DDR_CH0_DQ7_B: sheet 04_DRAM-LPDDR4X_200P_1X32bit/DDR_CH0_DQ7_B, sheet 06_RK3588MQ/DDR_CH0_DQ7_B
DDR_CH0_DQ7_C: sheet 04_DRAM-LPDDR4X_200P_1X32bit/DDR_CH0_DQ7_C
DDR_CH0_DQ7_D: sheet 04_DRAM-LPDDR4X_200P_1X32bit/DDR_CH0_DQ7_D
DDR_CH0_DQ8_A: sheet 04_DRAM-LPDDR4X_200P_1X32bit/DDR_CH0_DQ8_A, sheet 06_RK3588MQ/DDR_CH0_DQ8_A
DDR_CH0_DQ8_B: sheet 04_DRAM-LPDDR4X_200P_1X32bit/DDR_CH0_DQ8_B, sheet 06_RK3588MQ/DDR_CH0_DQ8_B
DDR_CH0_DQ8_C: sheet 04_DRAM-LPDDR4X_200P_1X32bit/DDR_CH0_DQ8_C
DDR_CH0_DQ8_D: sheet 04_DRAM-LPDDR4X_200P_1X32bit/DDR_CH0_DQ8_D
DDR_CH0_DQ9_A: sheet 04_DRAM-LPDDR4X_200P_1X32bit/DDR_CH0_DQ9_A, sheet 06_RK3588MQ/DDR_CH0_DQ9_A
DDR_CH0_DQ9_B: sheet 04_DRAM-LPDDR4X_200P_1X32bit/DDR_CH0_DQ9_B, sheet 06_RK3588MQ/DDR_CH0_DQ9_B
DDR_CH0_DQ9_C: sheet 04_DRAM-LPDDR4X_200P_1X32bit/DDR_CH0_DQ9_C
DDR_CH0_DQ9_D: sheet 04_DRAM-LPDDR4X_200P_1X32bit/DDR_CH0_DQ9_D
DDR_CH0_DQ10_A: sheet 04_DRAM-LPDDR4X_200P_1X32bit/DDR_CH0_DQ10_A, sheet 06_RK3588MQ/DDR_CH0_DQ10_A
DDR_CH0_DQ10_B: sheet 04_DRAM-LPDDR4X_200P_1X32bit/DDR_CH0_DQ10_B, sheet 06_RK3588MQ/DDR_CH0_DQ10_B
DDR_CH0_DQ10_C: sheet 04_DRAM-LPDDR4X_200P_1X32bit/DDR_CH0_DQ10_C
DDR_CH0_DQ10_D: sheet 04_DRAM-LPDDR4X_200P_1X32bit/DDR_CH0_DQ10_D
DDR_CH0_DQ11_A: sheet 04_DRAM-LPDDR4X_200P_1X32bit/DDR_CH0_DQ11_A, sheet 06_RK3588MQ/DDR_CH0_DQ11_A
DDR_CH0_DQ11_B: sheet 04_DRAM-LPDDR4X_200P_1X32bit/DDR_CH0_DQ11_B, sheet 06_RK3588MQ/DDR_CH0_DQ11_B
DDR_CH0_DQ11_C: sheet 04_DRAM-LPDDR4X_200P_1X32bit/DDR_CH0_DQ11_C
DDR_CH0_DQ11_D: sheet 04_DRAM-LPDDR4X_200P_1X32bit/DDR_CH0_DQ11_D
DDR_CH0_DQ12_A: sheet 04_DRAM-LPDDR4X_200P_1X32bit/DDR_CH0_DQ12_A, sheet 06_RK3588MQ/DDR_CH0_DQ12_A
DDR_CH0_DQ12_B: sheet 04_DRAM-LPDDR4X_200P_1X32bit/DDR_CH0_DQ12_B, sheet 06_RK3588MQ/DDR_CH0_DQ12_B
DDR_CH0_DQ12_C: sheet 04_DRAM-LPDDR4X_200P_1X32bit/DDR_CH0_DQ12_C
DDR_CH0_DQ12_D: sheet 04_DRAM-LPDDR4X_200P_1X32bit/DDR_CH0_DQ12_D
DDR_CH0_DQ13_A: sheet 04_DRAM-LPDDR4X_200P_1X32bit/DDR_CH0_DQ13_A, sheet 06_RK3588MQ/DDR_CH0_DQ13_A
DDR_CH0_DQ13_B: sheet 04_DRAM-LPDDR4X_200P_1X32bit/DDR_CH0_DQ13_B, sheet 06_RK3588MQ/DDR_CH0_DQ13_B
DDR_CH0_DQ13_C: sheet 04_DRAM-LPDDR4X_200P_1X32bit/DDR_CH0_DQ13_C
DDR_CH0_DQ13_D: sheet 04_DRAM-LPDDR4X_200P_1X32bit/DDR_CH0_DQ13_D
DDR_CH0_DQ14_A: sheet 04_DRAM-LPDDR4X_200P_1X32bit/DDR_CH0_DQ14_A, sheet 06_RK3588MQ/DDR_CH0_DQ14_A
DDR_CH0_DQ14_B: sheet 04_DRAM-LPDDR4X_200P_1X32bit/DDR_CH0_DQ14_B, sheet 06_RK3588MQ/DDR_CH0_DQ14_B
DDR_CH0_DQ14_C: sheet 04_DRAM-LPDDR4X_200P_1X32bit/DDR_CH0_DQ14_C
DDR_CH0_DQ14_D: sheet 04_DRAM-LPDDR4X_200P_1X32bit/DDR_CH0_DQ14_D
DDR_CH0_DQ15_A: sheet 04_DRAM-LPDDR4X_200P_1X32bit/DDR_CH0_DQ15_A, sheet 06_RK3588MQ/DDR_CH0_DQ15_A
DDR_CH0_DQ15_B: sheet 04_DRAM-LPDDR4X_200P_1X32bit/DDR_CH0_DQ15_B, sheet 06_RK3588MQ/DDR_CH0_DQ15_B
DDR_CH0_DQ15_C: sheet 04_DRAM-LPDDR4X_200P_1X32bit/DDR_CH0_DQ15_C
DDR_CH0_DQ15_D: sheet 04_DRAM-LPDDR4X_200P_1X32bit/DDR_CH0_DQ15_D
DDR_CH0_DQS0N_A: sheet 04_DRAM-LPDDR4X_200P_1X32bit/DDR_CH0_DQS0N_A, sheet 06_RK3588MQ/DDR_CH0_DQS0N_A
DDR_CH0_DQS0N_B: sheet 04_DRAM-LPDDR4X_200P_1X32bit/DDR_CH0_DQS0N_B, sheet 06_RK3588MQ/DDR_CH0_DQS0N_B
DDR_CH0_DQS0N_C: sheet 04_DRAM-LPDDR4X_200P_1X32bit/DDR_CH0_DQS0N_C
DDR_CH0_DQS0N_D: sheet 04_DRAM-LPDDR4X_200P_1X32bit/DDR_CH0_DQS0N_D
DDR_CH0_DQS0P_A: sheet 04_DRAM-LPDDR4X_200P_1X32bit/DDR_CH0_DQS0P_A, sheet 06_RK3588MQ/DDR_CH0_DQS0P_A
DDR_CH0_DQS0P_B: sheet 04_DRAM-LPDDR4X_200P_1X32bit/DDR_CH0_DQS0P_B, sheet 06_RK3588MQ/DDR_CH0_DQS0P_B
DDR_CH0_DQS0P_C: sheet 04_DRAM-LPDDR4X_200P_1X32bit/DDR_CH0_DQS0P_C
DDR_CH0_DQS0P_D: sheet 04_DRAM-LPDDR4X_200P_1X32bit/DDR_CH0_DQS0P_D
DDR_CH0_DQS1N_A: sheet 04_DRAM-LPDDR4X_200P_1X32bit/DDR_CH0_DQS1N_A, sheet 06_RK3588MQ/DDR_CH0_DQS1N_A
DDR_CH0_DQS1N_B: sheet 04_DRAM-LPDDR4X_200P_1X32bit/DDR_CH0_DQS1N_B, sheet 06_RK3588MQ/DDR_CH0_DQS1N_B
DDR_CH0_DQS1N_C: sheet 04_DRAM-LPDDR4X_200P_1X32bit/DDR_CH0_DQS1N_C
DDR_CH0_DQS1N_D: sheet 04_DRAM-LPDDR4X_200P_1X32bit/DDR_CH0_DQS1N_D
DDR_CH0_DQS1P_A: sheet 04_DRAM-LPDDR4X_200P_1X32bit/DDR_CH0_DQS1P_A, sheet 06_RK3588MQ/DDR_CH0_DQS1P_A
DDR_CH0_DQS1P_B: sheet 04_DRAM-LPDDR4X_200P_1X32bit/DDR_CH0_DQS1P_B, sheet 06_RK3588MQ/DDR_CH0_DQS1P_B
DDR_CH0_DQS1P_C: sheet 04_DRAM-LPDDR4X_200P_1X32bit/DDR_CH0_DQS1P_C
DDR_CH0_DQS1P_D: sheet 04_DRAM-LPDDR4X_200P_1X32bit/DDR_CH0_DQS1P_D
DDR_CH0_LP4/4X_CKE0/LP5_CS0_A: sheet 04_DRAM-LPDDR4X_200P_1X32bit/DDR_CH0_LP4/4X_CKE0/LP5_CS0_A, sheet 06_RK3588MQ/DDR_CH0_LP4/4X_CKE0/LP5_CS0_A
DDR_CH0_LP4/4X_CKE0/LP5_CS0_B: sheet 04_DRAM-LPDDR4X_200P_1X32bit/DDR_CH0_LP4/4X_CKE0/LP5_CS0_B, sheet 06_RK3588MQ/DDR_CH0_LP4/4X_CKE0/LP5_CS0_B
DDR_CH0_LP4/4X_CKE1/LP5_CS1_A: sheet 06_RK3588MQ/DDR_CH0_LP4/4X_CKE1/LP5_CS1_A
DDR_CH0_LP4/4X_CKE1/LP5_CS1_B: sheet 06_RK3588MQ/DDR_CH0_LP4/4X_CKE1/LP5_CS1_B
DDR_CH0_LP4/4X_CS0_A: sheet 04_DRAM-LPDDR4X_200P_1X32bit/DDR_CH0_LP4/4X_CS0_A, sheet 06_RK3588MQ/DDR_CH0_LP4/4X_CS0_A
DDR_CH0_LP4/4X_CS0_B: sheet 04_DRAM-LPDDR4X_200P_1X32bit/DDR_CH0_LP4/4X_CS0_B, sheet 06_RK3588MQ/DDR_CH0_LP4/4X_CS0_B
DDR_CH0_LP4/4X_CS1_A: sheet 06_RK3588MQ/DDR_CH0_LP4/4X_CS1_A
DDR_CH0_LP4/4X_CS1_B: sheet 06_RK3588MQ/DDR_CH0_LP4/4X_CS1_B
DDR_CH1_A0_C: sheet 06_RK3588MQ/DDR_CH1_A0_C
DDR_CH1_A0_D: sheet 06_RK3588MQ/DDR_CH1_A0_D
DDR_CH1_A1_C: sheet 06_RK3588MQ/DDR_CH1_A1_C
DDR_CH1_A1_D: sheet 06_RK3588MQ/DDR_CH1_A1_D
DDR_CH1_A2_C: sheet 06_RK3588MQ/DDR_CH1_A2_C
DDR_CH1_A2_D: sheet 06_RK3588MQ/DDR_CH1_A2_D
DDR_CH1_A3_C: sheet 06_RK3588MQ/DDR_CH1_A3_C
DDR_CH1_A3_D: sheet 06_RK3588MQ/DDR_CH1_A3_D
DDR_CH1_A4_C: sheet 06_RK3588MQ/DDR_CH1_A4_C
DDR_CH1_A4_D: sheet 06_RK3588MQ/DDR_CH1_A4_D
DDR_CH1_A5_C: sheet 06_RK3588MQ/DDR_CH1_A5_C
DDR_CH1_A5_D: sheet 06_RK3588MQ/DDR_CH1_A5_D
DDR_CH1_CLKN_C: sheet 04_DRAM-LPDDR4X_200P_1X32bit/DDR_CH1_CLKN_C, sheet 06_RK3588MQ/DDR_CH1_CLKN_C
DDR_CH1_CLKN_D: sheet 06_RK3588MQ/DDR_CH1_CLKN_D
DDR_CH1_CLKP_C: sheet 04_DRAM-LPDDR4X_200P_1X32bit/DDR_CH1_CLKP_C, sheet 06_RK3588MQ/DDR_CH1_CLKP_C
DDR_CH1_CLKP_D: sheet 06_RK3588MQ/DDR_CH1_CLKP_D
DDR_CH1_DM0_C: sheet 06_RK3588MQ/DDR_CH1_DM0_C
DDR_CH1_DM0_D: sheet 06_RK3588MQ/DDR_CH1_DM0_D
DDR_CH1_DM1_C: sheet 06_RK3588MQ/DDR_CH1_DM1_C
DDR_CH1_DM1_D: sheet 06_RK3588MQ/DDR_CH1_DM1_D
DDR_CH1_DQ0_C: sheet 06_RK3588MQ/DDR_CH1_DQ0_C
DDR_CH1_DQ0_D: sheet 06_RK3588MQ/DDR_CH1_DQ0_D
DDR_CH1_DQ1_C: sheet 06_RK3588MQ/DDR_CH1_DQ1_C
DDR_CH1_DQ1_D: sheet 06_RK3588MQ/DDR_CH1_DQ1_D
DDR_CH1_DQ2_C: sheet 06_RK3588MQ/DDR_CH1_DQ2_C
DDR_CH1_DQ2_D: sheet 06_RK3588MQ/DDR_CH1_DQ2_D
DDR_CH1_DQ3_C: sheet 06_RK3588MQ/DDR_CH1_DQ3_C
DDR_CH1_DQ3_D: sheet 06_RK3588MQ/DDR_CH1_DQ3_D
DDR_CH1_DQ4_C: sheet 06_RK3588MQ/DDR_CH1_DQ4_C
DDR_CH1_DQ4_D: sheet 06_RK3588MQ/DDR_CH1_DQ4_D
DDR_CH1_DQ5_C: sheet 06_RK3588MQ/DDR_CH1_DQ5_C
DDR_CH1_DQ5_D: sheet 06_RK3588MQ/DDR_CH1_DQ5_D
DDR_CH1_DQ6_C: sheet 06_RK3588MQ/DDR_CH1_DQ6_C
DDR_CH1_DQ6_D: sheet 06_RK3588MQ/DDR_CH1_DQ6_D
DDR_CH1_DQ7_C: sheet 06_RK3588MQ/DDR_CH1_DQ7_C
DDR_CH1_DQ7_D: sheet 06_RK3588MQ/DDR_CH1_DQ7_D
DDR_CH1_DQ8_C: sheet 06_RK3588MQ/DDR_CH1_DQ8_C
DDR_CH1_DQ8_D: sheet 06_RK3588MQ/DDR_CH1_DQ8_D
DDR_CH1_DQ9_C: sheet 06_RK3588MQ/DDR_CH1_DQ9_C
DDR_CH1_DQ9_D: sheet 06_RK3588MQ/DDR_CH1_DQ9_D
DDR_CH1_DQ10_C: sheet 06_RK3588MQ/DDR_CH1_DQ10_C
DDR_CH1_DQ10_D: sheet 06_RK3588MQ/DDR_CH1_DQ10_D
DDR_CH1_DQ11_C: sheet 06_RK3588MQ/DDR_CH1_DQ11_C
DDR_CH1_DQ11_D: sheet 06_RK3588MQ/DDR_CH1_DQ11_D
DDR_CH1_DQ12_C: sheet 06_RK3588MQ/DDR_CH1_DQ12_C
DDR_CH1_DQ12_D: sheet 06_RK3588MQ/DDR_CH1_DQ12_D
DDR_CH1_DQ13_C: sheet 06_RK3588MQ/DDR_CH1_DQ13_C
DDR_CH1_DQ13_D: sheet 06_RK3588MQ/DDR_CH1_DQ13_D
DDR_CH1_DQ14_C: sheet 06_RK3588MQ/DDR_CH1_DQ14_C
DDR_CH1_DQ14_D: sheet 06_RK3588MQ/DDR_CH1_DQ14_D
DDR_CH1_DQ15_C: sheet 06_RK3588MQ/DDR_CH1_DQ15_C
DDR_CH1_DQ15_D: sheet 06_RK3588MQ/DDR_CH1_DQ15_D
DDR_CH1_DQS0N_C: sheet 06_RK3588MQ/DDR_CH1_DQS0N_C
DDR_CH1_DQS0N_D: sheet 06_RK3588MQ/DDR_CH1_DQS0N_D
DDR_CH1_DQS0P_C: sheet 06_RK3588MQ/DDR_CH1_DQS0P_C
DDR_CH1_DQS0P_D: sheet 06_RK3588MQ/DDR_CH1_DQS0P_D
DDR_CH1_DQS1N_C: sheet 06_RK3588MQ/DDR_CH1_DQS1N_C
DDR_CH1_DQS1N_D: sheet 06_RK3588MQ/DDR_CH1_DQS1N_D
DDR_CH1_DQS1P_C: sheet 06_RK3588MQ/DDR_CH1_DQS1P_C
DDR_CH1_DQS1P_D: sheet 06_RK3588MQ/DDR_CH1_DQS1P_D
DDR_CH1_LP4/4X_CKE0/LP5_CS0_C: sheet 04_DRAM-LPDDR4X_200P_1X32bit/DDR_CH1_LP4/4X_CKE0/LP5_CS0_C, sheet 06_RK3588MQ/DDR_CH1_LP4/4X_CKE0/LP5_CS0_C
DDR_CH1_LP4/4X_CKE0/LP5_CS0_D: sheet 04_DRAM-LPDDR4X_200P_1X32bit/DDR_CH1_LP4/4X_CKE0/LP5_CS0_D, sheet 06_RK3588MQ/DDR_CH1_LP4/4X_CKE0/LP5_CS0_D
DDR_CH1_LP4/4X_CKE1/LP5_CS1_C: sheet 06_RK3588MQ/DDR_CH1_LP4/4X_CKE1/LP5_CS1_C
DDR_CH1_LP4/4X_CKE1/LP5_CS1_D: sheet 06_RK3588MQ/DDR_CH1_LP4/4X_CKE1/LP5_CS1_D
DDR_CH1_LP4/4X_CS0_C: sheet 04_DRAM-LPDDR4X_200P_1X32bit/DDR_CH1_LP4/4X_CS0_C, sheet 06_RK3588MQ/DDR_CH1_LP4/4X_CS0_C
DDR_CH1_LP4/4X_CS0_D: sheet 04_DRAM-LPDDR4X_200P_1X32bit/DDR_CH1_LP4/4X_CS0_D, sheet 06_RK3588MQ/DDR_CH1_LP4/4X_CS0_D
DDR_CH1_LP4/4X_CS1_C: sheet 06_RK3588MQ/DDR_CH1_LP4/4X_CS1_C
DDR_CH1_LP4/4X_CS1_D: sheet 06_RK3588MQ/DDR_CH1_LP4/4X_CS1_D
DDR_RESET: sheet 04_DRAM-LPDDR4X_200P_1X32bit/DDR_RESET, sheet 06_RK3588MQ/DDR_RESET
eMMC_CLKOUT: sheet 05_eMMC/eMMC_CLKOUT, sheet 06_RK3588MQ/eMMC_CLKOUT
eMMC_CMD: sheet 05_eMMC/eMMC_CMD, sheet 06_RK3588MQ/eMMC_CMD
eMMC_D0: sheet 05_eMMC/eMMC_D0, sheet 06_RK3588MQ/eMMC_D0
eMMC_D1: sheet 05_eMMC/eMMC_D1, sheet 06_RK3588MQ/eMMC_D1
eMMC_D2: sheet 05_eMMC/eMMC_D2, sheet 06_RK3588MQ/eMMC_D2
eMMC_D3: sheet 05_eMMC/eMMC_D3, sheet 06_RK3588MQ/eMMC_D3
eMMC_D4: sheet 05_eMMC/eMMC_D4, sheet 06_RK3588MQ/eMMC_D4
eMMC_D5: sheet 05_eMMC/eMMC_D5, sheet 06_RK3588MQ/eMMC_D5, sheet 06_RK3588MQ/eMMC_D6
eMMC_D6: sheet 05_eMMC/eMMC_D6
eMMC_D7: sheet 05_eMMC/eMMC_D7, sheet 06_RK3588MQ/eMMC_D7
eMMC_DATA_STROBE: sheet 05_eMMC/eMMC_DATA_STROBE, sheet 06_RK3588MQ/eMMC_DATA_STROBE
eMMC_RSTn: sheet 05_eMMC/eMMC_RSTn, sheet 06_RK3588MQ/eMMC_RSTn
I2C0_SCL_M2: sheet 06_RK3588MQ/I2C0_SCL_M2
I2C0_SDA_M2: sheet 06_RK3588MQ/I2C0_SDA_M2
I2C_SCL_M2: sheet 03_PWR_PMIC_RK860-2_RK860-3/I2C_SCL_M2
I2C_SDA_M2: sheet 03_PWR_PMIC_RK860-2_RK860-3/I2C_SDA_M2
J1_pin_22_3V3: sheet 06_RK3588MQ/J1_pin_22_3V3, sheet 07_J1_CONN/J1_pin_22_3V3
J1_pin_23_3V3: sheet 06_RK3588MQ/J1_pin_23_3V3, sheet 07_J1_CONN/J1_pin_23_3V3
J1_pin_24_VCCIO5: sheet 06_RK3588MQ/J1_pin_24_VCCIO5
J1_pin_24_VCIO5: sheet 07_J1_CONN/J1_pin_24_VCIO5
J1_pin_25_3V3: sheet 06_RK3588MQ/J1_pin_25_3V3, sheet 07_J1_CONN/J1_pin_25_3V3
J1_pin_26_VCCIO5: sheet 06_RK3588MQ/J1_pin_26_VCCIO5
J1_pin_26_VCIO5: sheet 07_J1_CONN/J1_pin_26_VCIO5
J1_pin_27_3V3: sheet 06_RK3588MQ/J1_pin_27_3V3, sheet 07_J1_CONN/J1_pin_27_3V3
J1_pin_28_VCCIO5: sheet 06_RK3588MQ/J1_pin_28_VCCIO5
J1_pin_28_VCIO5: sheet 07_J1_CONN/J1_pin_28_VCIO5
J1_pin_29_3V3: sheet 06_RK3588MQ/J1_pin_29_3V3, sheet 07_J1_CONN/J1_pin_29_3V3
J1_pin_30_3V3: sheet 06_RK3588MQ/J1_pin_30_3V3, sheet 07_J1_CONN/J1_pin_30_3V3
J1_pin_31_1V8: sheet 07_J1_CONN/J1_pin_31_1V8
J1_pin_32_3V3: sheet 06_RK3588MQ/J1_pin_32_3V3, sheet 07_J1_CONN/J1_pin_32_3V3
J1_pin_33_3V3: sheet 06_RK3588MQ/J1_pin_33_3V3, sheet 06_RK3588MQ/J1_pin_31_3V3, sheet 07_J1_CONN/J1_pin_33_3V3
J1_pin_34_3V3: sheet 06_RK3588MQ/J1_pin_34_3V3, sheet 07_J1_CONN/J1_pin_34_3V3
J1_pin_35_1V8: sheet 07_J1_CONN/J1_pin_35_1V8
J1_pin_36_3V3: sheet 06_RK3588MQ/J1_pin_36_3V3, sheet 07_J1_CONN/J1_pin_36_3V3
J1_pin_37_3V3: sheet 06_RK3588MQ/J1_pin_37_3V3, sheet 06_RK3588MQ/J1_pin_35_1V8, sheet 07_J1_CONN/J1_pin_37_3V3
J1_pin_38_3V3: sheet 06_RK3588MQ/J1_pin_38_3V3, sheet 07_J1_CONN/J1_pin_38_3V3
J1_pin_39_VCCIO5: sheet 06_RK3588MQ/J1_pin_39_VCCIO5
J1_pin_39_VCIO5: sheet 07_J1_CONN/J1_pin_39_VCIO5
J1_pin_40_3V3: sheet 06_RK3588MQ/J1_pin_40_3V3, sheet 07_J1_CONN/J1_pin_40_3V3
J1_pin_41_VCCIO5: sheet 06_RK3588MQ/J1_pin_41_VCCIO5
J1_pin_41_VCIO5: sheet 07_J1_CONN/J1_pin_41_VCIO5
J1_pin_42_3V3: sheet 06_RK3588MQ/J1_pin_42_3V3, sheet 07_J1_CONN/J1_pin_42_3V3
J1_pin_43_VCCIO5: sheet 06_RK3588MQ/J1_pin_43_VCCIO5
J1_pin_43_VCIO5: sheet 07_J1_CONN/J1_pin_43_VCIO5
J1_pin_46_1V8: sheet 06_RK3588MQ/J1_pin_46_1V8, sheet 07_J1_CONN/J1_pin_46_1V8
J1_pin_48_VCCIO_SD_S0: sheet 06_RK3588MQ/J1_pin_48_VCCIO_SD_S0
J1_pin_48_VCIO_SD_S0: sheet 07_J1_CONN/J1_pin_48_VCIO_SD_S0
J1_pin_50_VCCIO_SD_S0: sheet 06_RK3588MQ/J1_pin_50_VCCIO_SD_S0
J1_pin_50_VCIO_SD_S0: sheet 07_J1_CONN/J1_pin_50_VCIO_SD_S0
J1_pin_52_VCCIO_SD_S0: sheet 06_RK3588MQ/J1_pin_52_VCCIO_SD_S0
J1_pin_52_VCIO_SD_S0: sheet 07_J1_CONN/J1_pin_52_VCIO_SD_S0
J1_pin_54_VCCIO_SD_S0: sheet 06_RK3588MQ/J1_pin_54_VCCIO_SD_S0
J1_pin_54_VCIO_SD_S0: sheet 07_J1_CONN/J1_pin_54_VCIO_SD_S0
J1_pin_56_VCCIO_SD_S0: sheet 06_RK3588MQ/J1_pin_56_VCCIO_SD_S0
J1_pin_56_VCIO_SD_S0: sheet 07_J1_CONN/J1_pin_56_VCIO_SD_S0
J1_pin_58_VCCIO_SD_S0: sheet 06_RK3588MQ/J1_pin_58_VCCIO_SD_S0
J1_pin_58_VCIO_SD_S0: sheet 07_J1_CONN/J1_pin_58_VCIO_SD_S0
J1_pin_62_3V3: sheet 06_RK3588MQ/J1_pin_62_3V3, sheet 07_J1_CONN/J1_pin_62_3V3
J1_pin_64_3V3: sheet 06_RK3588MQ/J1_pin_64_3V3, sheet 07_J1_CONN/J1_pin_64_3V3
J1_pin_65: sheet 06_RK3588MQ/J1_pin_65, sheet 06_RK3588MQ/J1_pin_67, sheet 07_J1_CONN/J1_pin_65
J1_pin_66: sheet 06_RK3588MQ/J1_pin_66, sheet 07_J1_CONN/J1_pin_66
J1_pin_67: sheet 07_J1_CONN/J1_pin_67
J1_pin_68: sheet 06_RK3588MQ/J1_pin_68, sheet 07_J1_CONN/J1_pin_68
J1_pin_69: sheet 06_RK3588MQ/J1_pin_69, sheet 06_RK3588MQ/J1_pin_71, sheet 07_J1_CONN/J1_pin_69
J1_pin_70: sheet 06_RK3588MQ/J1_pin_70, sheet 07_J1_CONN/J1_pin_70
J1_pin_71: sheet 07_J1_CONN/J1_pin_71
J1_pin_72: sheet 06_RK3588MQ/J1_pin_72, sheet 07_J1_CONN/J1_pin_72
J1_pin_73: sheet 06_RK3588MQ/J1_pin_73, sheet 06_RK3588MQ/J1_pin_75, sheet 07_J1_CONN/J1_pin_73
J1_pin_74: sheet 06_RK3588MQ/J1_pin_74, sheet 07_J1_CONN/J1_pin_74
J1_pin_75: sheet 07_J1_CONN/J1_pin_75
J1_pin_76: sheet 06_RK3588MQ/J1_pin_76, sheet 07_J1_CONN/J1_pin_76
J1_pin_77: sheet 06_RK3588MQ/J1_pin_77, sheet 07_J1_CONN/J1_pin_77
J1_pin_78: sheet 06_RK3588MQ/J1_pin_78, sheet 07_J1_CONN/J1_pin_78
J1_pin_79: sheet 06_RK3588MQ/J1_pin_79, sheet 07_J1_CONN/J1_pin_79
J1_pin_80: sheet 06_RK3588MQ/J1_pin_80, sheet 07_J1_CONN/J1_pin_80
J2_pin_28: sheet 06_RK3588MQ/J2_pin_28, sheet 08_J2_CONN/J2_pin_28
J2_pin_30: sheet 06_RK3588MQ/J2_pin_30, sheet 08_J2_CONN/J2_pin_30
J2_pin_32: sheet 06_RK3588MQ/J2_pin_32, sheet 08_J2_CONN/J2_pin_32
J2_pin_34: sheet 06_RK3588MQ/J2_pin_34, sheet 08_J2_CONN/J2_pin_34
J2_pin_36: sheet 06_RK3588MQ/J2_pin_36, sheet 08_J2_CONN/J2_pin_36
J2_pin_38: sheet 06_RK3588MQ/J2_pin_38, sheet 08_J2_CONN/J2_pin_38
J2_pin_40: sheet 06_RK3588MQ/J2_pin_40, sheet 08_J2_CONN/J2_pin_40
J2_pin_41: sheet 06_RK3588MQ/J2_pin_41, sheet 08_J2_CONN/J2_pin_41
J2_pin_42: sheet 06_RK3588MQ/J2_pin_42, sheet 08_J2_CONN/J2_pin_42
J2_pin_43: sheet 06_RK3588MQ/J2_pin_43, sheet 08_J2_CONN/J2_pin_43
J2_pin_44: sheet 06_RK3588MQ/J2_pin_44, sheet 08_J2_CONN/J2_pin_44
J2_pin_45: sheet 06_RK3588MQ/J2_pin_45, sheet 08_J2_CONN/J2_pin_45
J2_pin_46: sheet 06_RK3588MQ/J2_pin_46, sheet 08_J2_CONN/J2_pin_46
J2_pin_47: sheet 06_RK3588MQ/J2_pin_47, sheet 08_J2_CONN/J2_pin_47
J2_pin_49: sheet 06_RK3588MQ/J2_pin_49, sheet 08_J2_CONN/J2_pin_49
J2_pin_50: sheet 06_RK3588MQ/J2_pin_50, sheet 08_J2_CONN/J2_pin_50
J2_pin_51: sheet 06_RK3588MQ/J2_pin_51, sheet 08_J2_CONN/J2_pin_51
J2_pin_52: sheet 06_RK3588MQ/J2_pin_52, sheet 08_J2_CONN/J2_pin_52
J2_pin_53: sheet 06_RK3588MQ/J2_pin_53, sheet 08_J2_CONN/J2_pin_53
J2_pin_54: sheet 06_RK3588MQ/J2_pin_54, sheet 08_J2_CONN/J2_pin_54
J2_pin_55: sheet 06_RK3588MQ/J2_pin_55, sheet 08_J2_CONN/J2_pin_55
J2_pin_56: sheet 06_RK3588MQ/J2_pin_56, sheet 08_J2_CONN/J2_pin_56
J2_pin_58: sheet 06_RK3588MQ/J2_pin_58, sheet 08_J2_CONN/J2_pin_58
J2_pin_60: sheet 06_RK3588MQ/J2_pin_60, sheet 08_J2_CONN/J2_pin_60
J2_pin_62: sheet 06_RK3588MQ/J2_pin_62, sheet 08_J2_CONN/J2_pin_62
J2_pin_64: sheet 06_RK3588MQ/J2_pin_64, sheet 08_J2_CONN/J2_pin_64
J2_pin_66: sheet 06_RK3588MQ/J2_pin_66, sheet 08_J2_CONN/J2_pin_66
J2_pin_68: sheet 06_RK3588MQ/J2_pin_68, sheet 08_J2_CONN/J2_pin_68
J2_pin_94_1V8: sheet 06_RK3588MQ/J2_pin_94_1V8, sheet 08_J2_CONN/J2_pin_94_1V8
J2_pin_96_1V8: sheet 06_RK3588MQ/J2_pin_96_1V8, sheet 08_J2_CONN/J2_pin_96_1V8
J2_pin_98: sheet 06_RK3588MQ/J2_pin_98, sheet 06_RK3588MQ/J2_pin_100, sheet 08_J2_CONN/J2_pin_98
J2_pin_100: sheet 08_J2_CONN/J2_pin_100
J3_pin_2_3V3: sheet 06_RK3588MQ/J3_pin_2_3V3, sheet 09_J3_CONN/J3_pin_2_3V3
J3_pin_3: sheet 06_RK3588MQ/J3_pin_3, sheet 09_J3_CONN/J3_pin_3
J3_pin_4_3V3: sheet 06_RK3588MQ/J3_pin_4_3V3, sheet 09_J3_CONN/J3_pin_4_3V3
J3_pin_5: sheet 06_RK3588MQ/J3_pin_5, sheet 09_J3_CONN/J3_pin_5
J3_pin_6_1V8: sheet 06_RK3588MQ/J3_pin_6_1V8, sheet 09_J3_CONN/J3_pin_6_1V8
J3_pin_7: sheet 06_RK3588MQ/J3_pin_7, sheet 09_J3_CONN/J3_pin_7
J3_pin_8_1V8: sheet 06_RK3588MQ/J3_pin_8_1V8, sheet 09_J3_CONN/J3_pin_8_1V8
J3_pin_9: sheet 06_RK3588MQ/J3_pin_9, sheet 09_J3_CONN/J3_pin_9
J3_pin_10_1V8: sheet 06_RK3588MQ/J3_pin_10_1V8, sheet 09_J3_CONN/J3_pin_10_1V8
J3_pin_11: sheet 06_RK3588MQ/J3_pin_11, sheet 09_J3_CONN/J3_pin_11
J3_pin_12_1V8: sheet 06_RK3588MQ/J3_pin_12_1V8, sheet 09_J3_CONN/J3_pin_12_1V8
J3_pin_13: sheet 06_RK3588MQ/J3_pin_13, sheet 09_J3_CONN/J3_pin_13
J3_pin_14_1V8: sheet 06_RK3588MQ/J3_pin_14_1V8, sheet 09_J3_CONN/J3_pin_14_1V8
J3_pin_15: sheet 06_RK3588MQ/J3_pin_15, sheet 09_J3_CONN/J3_pin_15
J3_pin_16_1V8: sheet 06_RK3588MQ/J3_pin_16_1V8, sheet 09_J3_CONN/J3_pin_16_1V8
J3_pin_17: sheet 06_RK3588MQ/J3_pin_17, sheet 09_J3_CONN/J3_pin_17
J3_pin_18_1V8: sheet 06_RK3588MQ/J3_pin_18_1V8, sheet 09_J3_CONN/J3_pin_18_1V8
J3_pin_19: sheet 06_RK3588MQ/J3_pin_19, sheet 09_J3_CONN/J3_pin_19
J3_pin_20_VCCIO5: sheet 06_RK3588MQ/J3_pin_20_VCCIO5, sheet 09_J3_CONN/J3_pin_20_VCCIO5
J3_pin_21: sheet 06_RK3588MQ/J3_pin_21, sheet 09_J3_CONN/J3_pin_21
J3_pin_22_VCCIO5: sheet 06_RK3588MQ/J3_pin_22_VCCIO5, sheet 09_J3_CONN/J3_pin_22_VCCIO5
J3_pin_23: sheet 06_RK3588MQ/J3_pin_23, sheet 09_J3_CONN/J3_pin_23
J3_pin_24_1V8: sheet 06_RK3588MQ/J3_pin_24_1V8, sheet 09_J3_CONN/J3_pin_24_1V8
J3_pin_25: sheet 06_RK3588MQ/J3_pin_25, sheet 09_J3_CONN/J3_pin_25
J3_pin_26_1V8: sheet 06_RK3588MQ/J3_pin_26_1V8, sheet 09_J3_CONN/J3_pin_26_1V8
J3_pin_27: sheet 06_RK3588MQ/J3_pin_27, sheet 09_J3_CONN/J3_pin_27
J3_pin_28_1V8: sheet 09_J3_CONN/J3_pin_28_1V8
J3_pin_28_UART2_RX_M0_DEBUG: sheet 06_RK3588MQ/J3_pin_28_UART2_RX_M0_DEBUG
J3_pin_29: sheet 06_RK3588MQ/J3_pin_29, sheet 09_J3_CONN/J3_pin_29
J3_pin_30_1V8: sheet 09_J3_CONN/J3_pin_30_1V8
J3_pin_30_UART2_TX_M0_DEBUG: sheet 06_RK3588MQ/J3_pin_30_UART2_TX_M0_DEBUG
J3_pin_31: sheet 06_RK3588MQ/J3_pin_31, sheet 09_J3_CONN/J3_pin_31
J3_pin_32_VCCIO5: sheet 06_RK3588MQ/J3_pin_32_VCCIO5, sheet 09_J3_CONN/J3_pin_32_VCCIO5
J3_pin_33: sheet 06_RK3588MQ/J3_pin_33, sheet 09_J3_CONN/J3_pin_33
J3_pin_34_1V8: sheet 06_RK3588MQ/J3_pin_34_1V8, sheet 09_J3_CONN/J3_pin_34_1V8
J3_pin_35: sheet 06_RK3588MQ/J3_pin_35, sheet 09_J3_CONN/J3_pin_35
J3_pin_36_1V8: sheet 06_RK3588MQ/J3_pin_36_1V8, sheet 09_J3_CONN/J3_pin_36_1V8
J3_pin_37: sheet 06_RK3588MQ/J3_pin_37, sheet 09_J3_CONN/J3_pin_37
J3_pin_38_1V8: sheet 06_RK3588MQ/J3_pin_38_1V8, sheet 09_J3_CONN/J3_pin_38_1V8
J3_pin_40_1V8: sheet 06_RK3588MQ/J3_pin_40_1V8, sheet 09_J3_CONN/J3_pin_40_1V8
J3_pin_41_1V8: sheet 06_RK3588MQ/J3_pin_41_1V8, sheet 09_J3_CONN/J3_pin_41_1V8
J3_pin_42_1V8: sheet 06_RK3588MQ/J3_pin_42_1V8, sheet 09_J3_CONN/J3_pin_42_1V8
J3_pin_43_1V8: sheet 06_RK3588MQ/J3_pin_43_1V8, sheet 09_J3_CONN/J3_pin_43_1V8
J3_pin_44_1V8: sheet 06_RK3588MQ/J3_pin_44_1V8, sheet 09_J3_CONN/J3_pin_44_1V8
J3_pin_45_1V8: sheet 06_RK3588MQ/J3_pin_45_1V8, sheet 09_J3_CONN/J3_pin_45_1V8
J3_pin_46_1V8: sheet 06_RK3588MQ/J3_pin_46_1V8, sheet 09_J3_CONN/J3_pin_46_1V8
J3_pin_47_1V8: sheet 06_RK3588MQ/J3_pin_47_1V8, sheet 09_J3_CONN/J3_pin_47_1V8
J3_pin_48_1V8: sheet 06_RK3588MQ/J3_pin_48_1V8, sheet 09_J3_CONN/J3_pin_48_1V8
J3_pin_49_1V8: sheet 06_RK3588MQ/J3_pin_49_1V8, sheet 09_J3_CONN/J3_pin_49_1V8
J3_pin_50_1V8: sheet 06_RK3588MQ/J3_pin_50_1V8, sheet 09_J3_CONN/J3_pin_50_1V8
J3_pin_51_1V8: sheet 06_RK3588MQ/J3_pin_51_1V8, sheet 09_J3_CONN/J3_pin_51_1V8
J3_pin_52_1V8: sheet 06_RK3588MQ/J3_pin_52_1V8, sheet 09_J3_CONN/J3_pin_52_1V8
J3_pin_53_1V8: sheet 06_RK3588MQ/J3_pin_53_1V8, sheet 09_J3_CONN/J3_pin_53_1V8
J3_pin_54_1V8: sheet 06_RK3588MQ/J3_pin_54_1V8, sheet 09_J3_CONN/J3_pin_54_1V8
J3_pin_55_1V8: sheet 06_RK3588MQ/J3_pin_55_1V8, sheet 09_J3_CONN/J3_pin_55_1V8
J3_pin_56_1V8: sheet 06_RK3588MQ/J3_pin_56_1V8, sheet 09_J3_CONN/J3_pin_56_1V8
J3_pin_57_1V8: sheet 06_RK3588MQ/J3_pin_57_1V8, sheet 09_J3_CONN/J3_pin_57_1V8
J3_pin_58_1V8: sheet 06_RK3588MQ/J3_pin_58_1V8, sheet 09_J3_CONN/J3_pin_58_1V8
J3_pin_59_1V8: sheet 06_RK3588MQ/J3_pin_59_1V8, sheet 09_J3_CONN/J3_pin_59_1V8
J3_pin_60_1V8: sheet 06_RK3588MQ/J3_pin_60_1V8, sheet 09_J3_CONN/J3_pin_60_1V8
J3_pin_61_1V8: sheet 06_RK3588MQ/J3_pin_61_1V8, sheet 09_J3_CONN/J3_pin_61_1V8
J3_pin_62_1V8: sheet 06_RK3588MQ/J3_pin_62_1V8, sheet 09_J3_CONN/J3_pin_62_1V8
J3_pin_63_1V8: sheet 06_RK3588MQ/J3_pin_63_1V8, sheet 09_J3_CONN/J3_pin_63_1V8
J3_pin_64_1V8: sheet 06_RK3588MQ/J3_pin_64_1V8, sheet 09_J3_CONN/J3_pin_64_1V8
J3_pin_66_1V8: sheet 06_RK3588MQ/J3_pin_66_1V8, sheet 09_J3_CONN/J3_pin_66_1V8
J3_pin_67_VCCIO5: sheet 06_RK3588MQ/J3_pin_67_VCCIO5, sheet 09_J3_CONN/J3_pin_67_VCCIO5
J3_pin_68_1V8: sheet 06_RK3588MQ/J3_pin_68_1V8, sheet 09_J3_CONN/J3_pin_68_1V8
J3_pin_69_1V8: sheet 06_RK3588MQ/J3_pin_69_1V8, sheet 09_J3_CONN/J3_pin_69_1V8
J3_pin_70_1V8: sheet 06_RK3588MQ/J3_pin_70_1V8, sheet 09_J3_CONN/J3_pin_70_1V8
J3_pin_71_1V8: sheet 06_RK3588MQ/J3_pin_71_1V8, sheet 09_J3_CONN/J3_pin_71_1V8
J3_pin_72_1V8: sheet 06_RK3588MQ/J3_pin_72_1V8, sheet 09_J3_CONN/J3_pin_72_1V8
J3_pin_73_1V8: sheet 06_RK3588MQ/J3_pin_73_1V8, sheet 09_J3_CONN/J3_pin_73_1V8
J3_pin_74_VCCIO5: sheet 06_RK3588MQ/J3_pin_74_VCCIO5, sheet 09_J3_CONN/J3_pin_74_VCCIO5
J3_pin_75_1V8: sheet 06_RK3588MQ/J3_pin_75_1V8, sheet 09_J3_CONN/J3_pin_75_1V8
J3_pin_76_VCCIO5: sheet 06_RK3588MQ/J3_pin_76_VCCIO5, sheet 09_J3_CONN/J3_pin_76_VCCIO5
J3_pin_77_1V8: sheet 06_RK3588MQ/J3_pin_77_1V8, sheet 09_J3_CONN/J3_pin_77_1V8
J3_pin_78_VCCIO5: sheet 06_RK3588MQ/J3_pin_78_VCCIO5, sheet 09_J3_CONN/J3_pin_78_VCCIO5
J3_pin_79_1V8: sheet 06_RK3588MQ/J3_pin_79_1V8, sheet 09_J3_CONN/J3_pin_79_1V8
J3_pin_80_VCCIO5: sheet 06_RK3588MQ/J3_pin_80_VCCIO5, sheet 09_J3_CONN/J3_pin_80_VCCIO5
J4_pin_10: sheet 06_RK3588MQ/J4_pin_10, sheet 06_RK3588MQ/J4_pin_12, sheet 10_J4_CONN/J4_pin_10
J4_pin_12: sheet 10_J4_CONN/J4_pin_12
J4_pin_14: sheet 06_RK3588MQ/J4_pin_16, sheet 06_RK3588MQ/J4_pin_14, sheet 10_J4_CONN/J4_pin_14
J4_pin_16: sheet 10_J4_CONN/J4_pin_16
J4_pin_18: sheet 06_RK3588MQ/J4_pin_20, sheet 06_RK3588MQ/J4_pin_18, sheet 10_J4_CONN/J4_pin_18
J4_pin_20: sheet 10_J4_CONN/J4_pin_20
J4_pin_22: sheet 06_RK3588MQ/J4_pin_22, sheet 06_RK3588MQ/J4_pin_24, sheet 10_J4_CONN/J4_pin_22
J4_pin_24: sheet 10_J4_CONN/J4_pin_24
J4_pin_26: sheet 06_RK3588MQ/J4_pin_28, sheet 06_RK3588MQ/J4_pin_26, sheet 10_J4_CONN/J4_pin_26
J4_pin_28: sheet 10_J4_CONN/J4_pin_28
J4_pin_30: sheet 06_RK3588MQ/J4_pin_32, sheet 06_RK3588MQ/J4_pin_30, sheet 10_J4_CONN/J4_pin_30
J4_pin_32: sheet 10_J4_CONN/J4_pin_32
J4_pin_35_1V8: sheet 06_RK3588MQ/J4_pin_35_1V8, sheet 10_J4_CONN/J4_pin_35_1V8
J4_pin_37_1V8: sheet 06_RK3588MQ/J4_pin_37_1V8, sheet 10_J4_CONN/J4_pin_37_1V8
J4_pin_38_1V8: sheet 06_RK3588MQ/J4_pin_38_1V8, sheet 10_J4_CONN/J4_pin_38_1V8
J4_pin_39_1V8: sheet 06_RK3588MQ/J4_pin_39_1V8, sheet 10_J4_CONN/J4_pin_39_1V8
J4_pin_40_1V8: sheet 06_RK3588MQ/J4_pin_40_1V8, sheet 10_J4_CONN/J4_pin_40_1V8
J4_pin_41_1V8: sheet 06_RK3588MQ/J4_pin_41_1V8, sheet 10_J4_CONN/J4_pin_41_1V8
J4_pin_42_1V8: sheet 06_RK3588MQ/J4_pin_42_1V8
J4_pin_43_3V3: sheet 06_RK3588MQ/J4_pin_43_3V3, sheet 10_J4_CONN/J4_pin_43_3V3
J4_pin_46_3V3: sheet 06_RK3588MQ/J4_pin_46_3V3, sheet 10_J4_CONN/J4_pin_46_3V3
J4_pin_47_1V8: sheet 06_RK3588MQ/J4_pin_47_1V8, sheet 10_J4_CONN/J4_pin_47_1V8
J4_pin_49_1V8: sheet 06_RK3588MQ/J4_pin_49_1V8, sheet 10_J4_CONN/J4_pin_49_1V8
J4_pin_50_1V8: sheet 06_RK3588MQ/J4_pin_50_1V8, sheet 10_J4_CONN/J4_pin_50_1V8
J4_pin_51_1V8: sheet 06_RK3588MQ/J4_pin_51_1V8, sheet 10_J4_CONN/J4_pin_51_1V8
J4_pin_52_1V8: sheet 06_RK3588MQ/J4_pin_52_1V8, sheet 10_J4_CONN/J4_pin_52_1V8
J4_pin_53_1V8: sheet 06_RK3588MQ/J4_pin_53_1V8, sheet 10_J4_CONN/J4_pin_53_1V8
J4_pin_54_1V8: sheet 06_RK3588MQ/J4_pin_54_1V8, sheet 10_J4_CONN/J4_pin_54_1V8
J4_pin_55_1V8: sheet 06_RK3588MQ/J4_pin_55_1V8, sheet 10_J4_CONN/J4_pin_55_1V8
J4_pin_56_1V8: sheet 06_RK3588MQ/J4_pin_56_1V8, sheet 10_J4_CONN/J4_pin_56_1V8
J4_pin_57_1V8: sheet 06_RK3588MQ/J4_pin_57_1V8, sheet 10_J4_CONN/J4_pin_57_1V8
J4_pin_58_1V8: sheet 06_RK3588MQ/J4_pin_58_1V8, sheet 10_J4_CONN/J4_pin_58_1V8
J4_pin_59_VCCIO5: sheet 06_RK3588MQ/J4_pin_59_VCCIO5, sheet 10_J4_CONN/J4_pin_59_VCCIO5
J4_pin_60_1V8: sheet 06_RK3588MQ/J4_pin_60_1V8, sheet 10_J4_CONN/J4_pin_60_1V8
J4_pin_61_VCCIO5: sheet 06_RK3588MQ/J4_pin_61_VCCIO5, sheet 10_J4_CONN/J4_pin_61_VCCIO5
J4_pin_62_1V8: sheet 06_RK3588MQ/J4_pin_62_1V8, sheet 10_J4_CONN/J4_pin_62_1V8
J4_pin_63_VCCIO5: sheet 06_RK3588MQ/J4_pin_63_VCCIO5, sheet 10_J4_CONN/J4_pin_63_VCCIO5
J4_pin_64_1V8: sheet 06_RK3588MQ/J4_pin_64_1V8, sheet 10_J4_CONN/J4_pin_64_1V8
J4_pin_65_VCCIO5: sheet 06_RK3588MQ/J4_pin_65_VCCIO5, sheet 10_J4_CONN/J4_pin_65_VCCIO5
J4_pin_66_VCCIO5: sheet 06_RK3588MQ/J4_pin_66_VCCIO5, sheet 10_J4_CONN/J4_pin_66_VCCIO5
J4_pin_67_VCCIO5: sheet 06_RK3588MQ/J4_pin_67_VCCIO5, sheet 10_J4_CONN/J4_pin_67_VCCIO5
J4_pin_68_1V8: sheet 06_RK3588MQ/J4_pin_68_1V8, sheet 10_J4_CONN/J4_pin_68_1V8
J4_pin_69_VCCIO5: sheet 06_RK3588MQ/J4_pin_69_VCCIO5, sheet 10_J4_CONN/J4_pin_69_VCCIO5
J4_pin_70_1V8: sheet 06_RK3588MQ/J4_pin_70_1V8, sheet 10_J4_CONN/J4_pin_70_1V8
J4_pin_71_VCCIO5: sheet 06_RK3588MQ/J4_pin_71_VCCIO5, sheet 10_J4_CONN/J4_pin_71_VCCIO5
J4_pin_72_VCCIO5: sheet 06_RK3588MQ/J4_pin_72_VCCIO5, sheet 10_J4_CONN/J4_pin_72_VCCIO5
J4_pin_73_VCCIO5: sheet 06_RK3588MQ/J4_pin_73_VCCIO5, sheet 10_J4_CONN/J4_pin_73_VCCIO5
J4_pin_74_VCCIO5: sheet 06_RK3588MQ/J4_pin_74_VCCIO5, sheet 10_J4_CONN/J4_pin_74_VCCIO5
J4_pin_75_VCCIO5: sheet 06_RK3588MQ/J4_pin_75_VCCIO5, sheet 10_J4_CONN/J4_pin_75_VCCIO5
J4_pin_76_VCCIO5: sheet 06_RK3588MQ/J4_pin_76_VCCIO5, sheet 10_J4_CONN/J4_pin_76_VCCIO5
J4_pin_77_VCCIO5: sheet 06_RK3588MQ/J4_pin_77_VCCIO5, sheet 10_J4_CONN/J4_pin_77_VCCIO5
J4_pin_78_VCCIO5: sheet 06_RK3588MQ/J4_pin_78_VCCIO5, sheet 10_J4_CONN/J4_pin_78_VCCIO5
J4_pin_79_VCCIO5: sheet 06_RK3588MQ/J4_pin_79_VCCIO5, sheet 10_J4_CONN/J4_pin_79_VCCIO5
J4_pin_80_VCCIO5: sheet 06_RK3588MQ/J4_pin_80_VCCIO5, sheet 10_J4_CONN/J4_pin_80_VCCIO5
MISO_RK806-1: sheet 02_PWR_PMIC_RK806-1/MISO_RK806-1, sheet 06_RK3588MQ/PMIC_PWR_CTRL3
NPOR: sheet 02_PWR_PMIC_RK806-1/NPOR, sheet 06_RK3588MQ/RESET_L, sheet 10_J4_CONN/NPOR
PMIC_EXT_EN_OUT: sheet 02_PWR_PMIC_RK806-1/PMIC_EXT_EN_OUT, sheet 03_PWR_PMIC_RK860-2_RK860-3/PMIC_EXT_EN_OUT, sheet 10_J4_CONN/PMIC_EXT_EN_OUT
PMIC_INT_L: sheet 02_PWR_PMIC_RK806-1/PMIC_INT_L, sheet 06_RK3588MQ/PMIC_INT_L
PMIC_PWR_CTRL1: sheet 06_RK3588MQ/PMIC_PWR_CTRL1
PMIC_PWR_CTRL2: sheet 06_RK3588MQ/PMIC_PWR_CTRL2
PMIC_SPI_CLK: sheet 06_RK3588MQ/PMIC_SPI_CLK
PWRCRTL1_RK806-1: sheet 02_PWR_PMIC_RK806-1/PWRCRTL1_RK806-1
PWRCRTL2_RK806-1: sheet 02_PWR_PMIC_RK806-1/PWRCRTL2_RK806-1
PWRON_L: sheet 02_PWR_PMIC_RK806-1/PWRON_L, sheet 10_J4_CONN/PWRON_L(RK806-1)
SPI_MOSI_RK806-1: sheet 02_PWR_PMIC_RK806-1/SPI_MOSI_RK806-1, sheet 06_RK3588MQ/PMIC_SPI_MOSI
VDC_EXT: sheet 02_PWR_PMIC_RK806-1/VDC_EXT, sheet 10_J4_CONN/VDC_EXT
VSEL2: sheet 03_PWR_PMIC_RK860-2_RK860-3/VSEL2, sheet 06_RK3588MQ/VSEL2
VSEL3: sheet 03_PWR_PMIC_RK860-2_RK860-3/VSEL3, sheet 06_RK3588MQ/VSEL3
VSEL6: sheet 03_PWR_PMIC_RK860-2_RK860-3/VSEL6, sheet 06_RK3588MQ/VSEL6

## Notes on the sheet
- DRAM-LPDDR4X (16 GB)
- PMIC RK806-1
- PMIC RK860-2/860-3
- eMMC FLASH (8GB)
- Перв. примен.
- Справ. №
- Подп. и дата
- Инв. № дубл.
- Взам. инв. №
- Разраб.
- Изм.
- Лист
- № докум.
- Подп.
- Дата
- Лит.
- Масса
- Масштаб
- Пров.
- Т.контр.
- Листов
- Инв. № подл.
- Утв.
- Н.контр.
- 2.106-A1
- Копировал
- Формат А1